# EAGLE schematic kicker (EAGLE 9.2.2)
DDRAWN: 03/07/19; FINISH: HASL; MATERIAL: FR-4; NCHECKED: Daniel Yang; NDRAWN: Will Stuckey; REV: 3.1-IGBT-EMG57; SCALE: 1:1; TITLE: SSL Kicker

## Sheet 1 of 9: Power
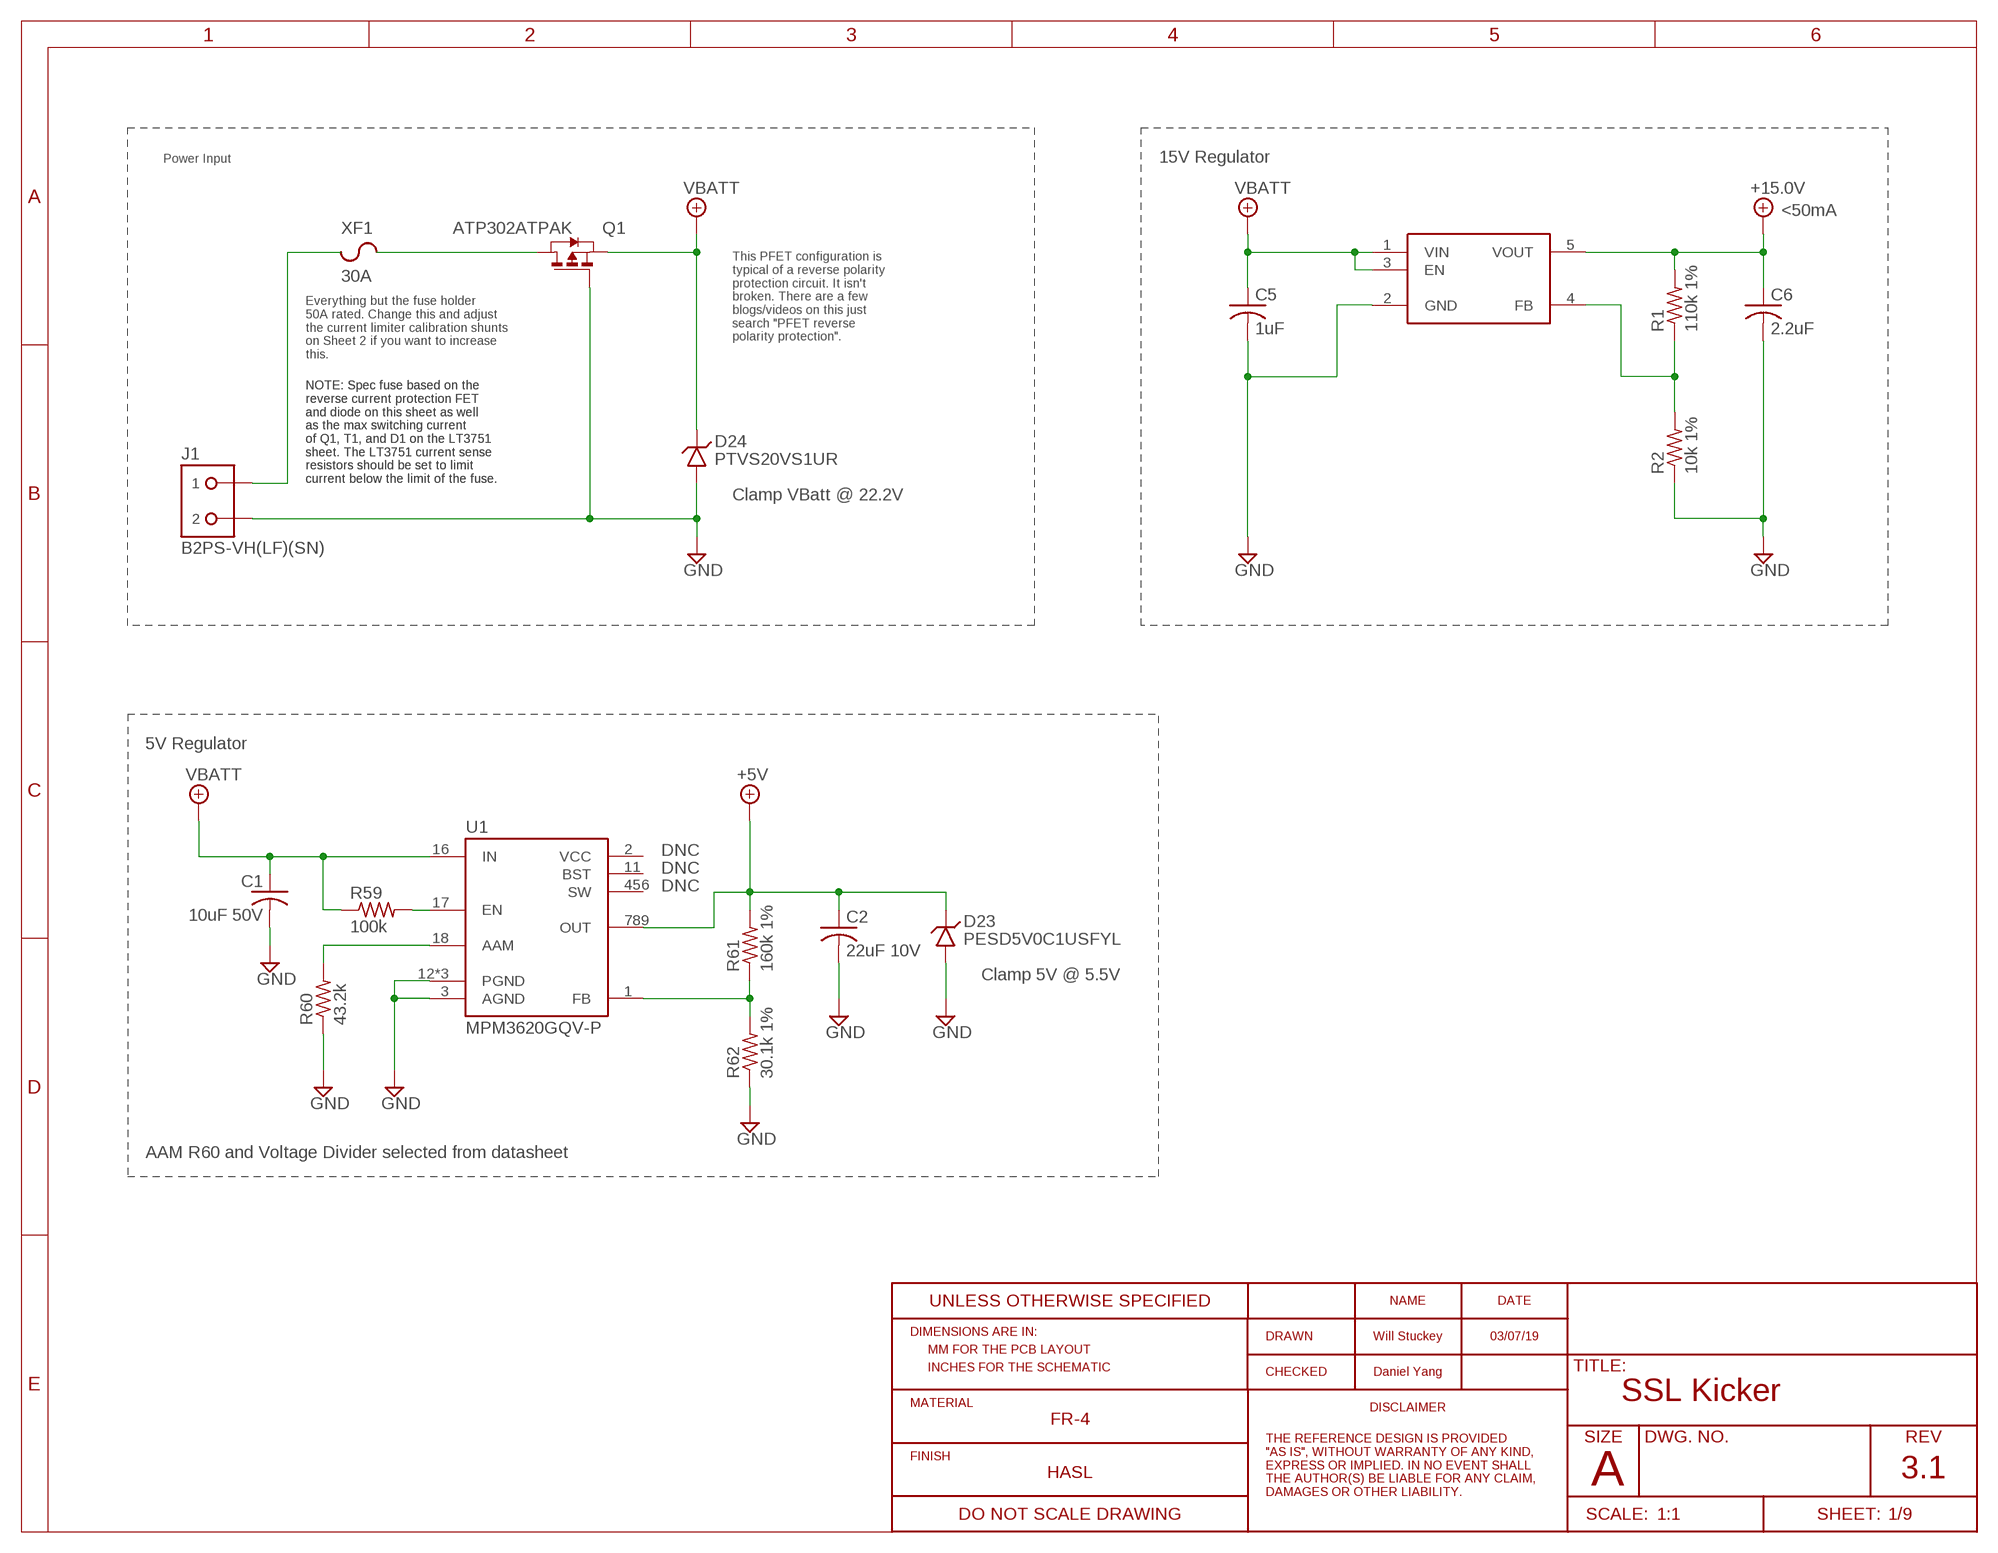
[diagram p0: schematic, sheet 1]
FRAME1 (RO_FRAME_A_L_20161226): REV: 3.1

### Parts
C1  10uF 50V  C-USC1206  [C1206]
C2  22uF 10V  C-USC0603  [C0603]
C5  1uF  C-USC0603  [C0603]
C6  2.2uF  C-USC0603  [C0603]
D23  PESD5V0C1USFYL  TVS0603  [R0603]
D24  PTVS20VS1UR  TVSSOD123W  [SOD123-W]
J1  B2PS-VH(LF)(SN)  [B2PS-CENTERED]
Q1  ATP302ATPAK  [TO460P950X150-3]
R1  110k 1%  R-US_R0603  [R0603]
R2  10k 1%  R-US_R0603  [R0603]
R59  100k  R-US_R0402  [R0402]
R60  43.2k  R-US_R0603  [R0603]
R61  160k 1%  R-US_R0402  [R0402]
R62  30.1k 1%  R-US_R0402  [R0402]
U1  MPM3620GQV-P  [MPM3620GQV-P]
U2  15V  MIC5235YM5SOT-23-5  [SOT95P280X145-5]
XF1  30A  3557-2  [3557-2]

### Nets
+5V: C2.1 D23.2(C) R61.2 U1.789(OUT) ; also sheet 3,6,7,8,9
+15.0V: C6.1 R1.2 U2.5(VOUT) ; also sheet 4,7
FB: R61.1 R62.2 U1.1(FB)
GND: C1.2 C2.2 C5.2 C6.2 D23.1(A) D24.A J1.2 Q1.1(G) R2.1 R60.1 R62.1 U1.3(AGND) U1.12(PGND) U1.13(PGND) U1.14(PGND) U2.2(GND) ; also sheet 2,3,4,5,6,7,8,9
N$9: Q1.3(D) XF1.3 XF1.4
N$16: R1.1 R2.2 U2.4(FB)
N$39: J1.1 XF1.1 XF1.2
REG_AAM: R60.2 U1.18(AAM)
REG_EN: R59.2 U1.17(EN)
VBATT: C1.1 C5.1 D24.C Q1.2(S) R59.1 U1.16(IN) U2.1(VIN) U2.3(EN) ; also sheet 2,3,5
Unconnected: U1.2(VCC) U1.11(BST) U1.456(SW)

### Notes on the sheet
- Power Input | 15V Regulator
- <50mA
- This PFET configuration is 
  typical of a reverse polarity 
  protection circuit. It isn't 
  broken. There are a few 
  blogs/videos on this just 
  search "PFET reverse 
  polarity protection".
- Everything but the fuse holder
  50A rated. Change this and adjust
  the current limiter calibration shunts
  on Sheet 2 if you want to increase
  this.
- NOTE: Spec fuse based on the
  reverse current protection FET
  and diode on this sheet as well
  as the max switching current
  of Q1, T1, and D1 on the LT3751
  sheet. The LT3751 current sense
  resistors should be set to limit
  current below the limit of the fuse.
- NOTE: Spec fuse based on the
  reverse current protection FET
  and diode on this sheet as well
  as the max switching current
  of Q1, T1, and D1 on the LT3751
  sheet. The LT3751 current sense
  resistors should be set to limit
  current below the limit of the fuse.
- Clamp VBatt @ 22.2V
- 5V Regulator
- DNC
- DNC
- DNC
- Clamp 5V @ 5.5V
- AAM R60 and Voltage Divider selected from datasheet

## Sheet 2 of 9: HV - Regulation
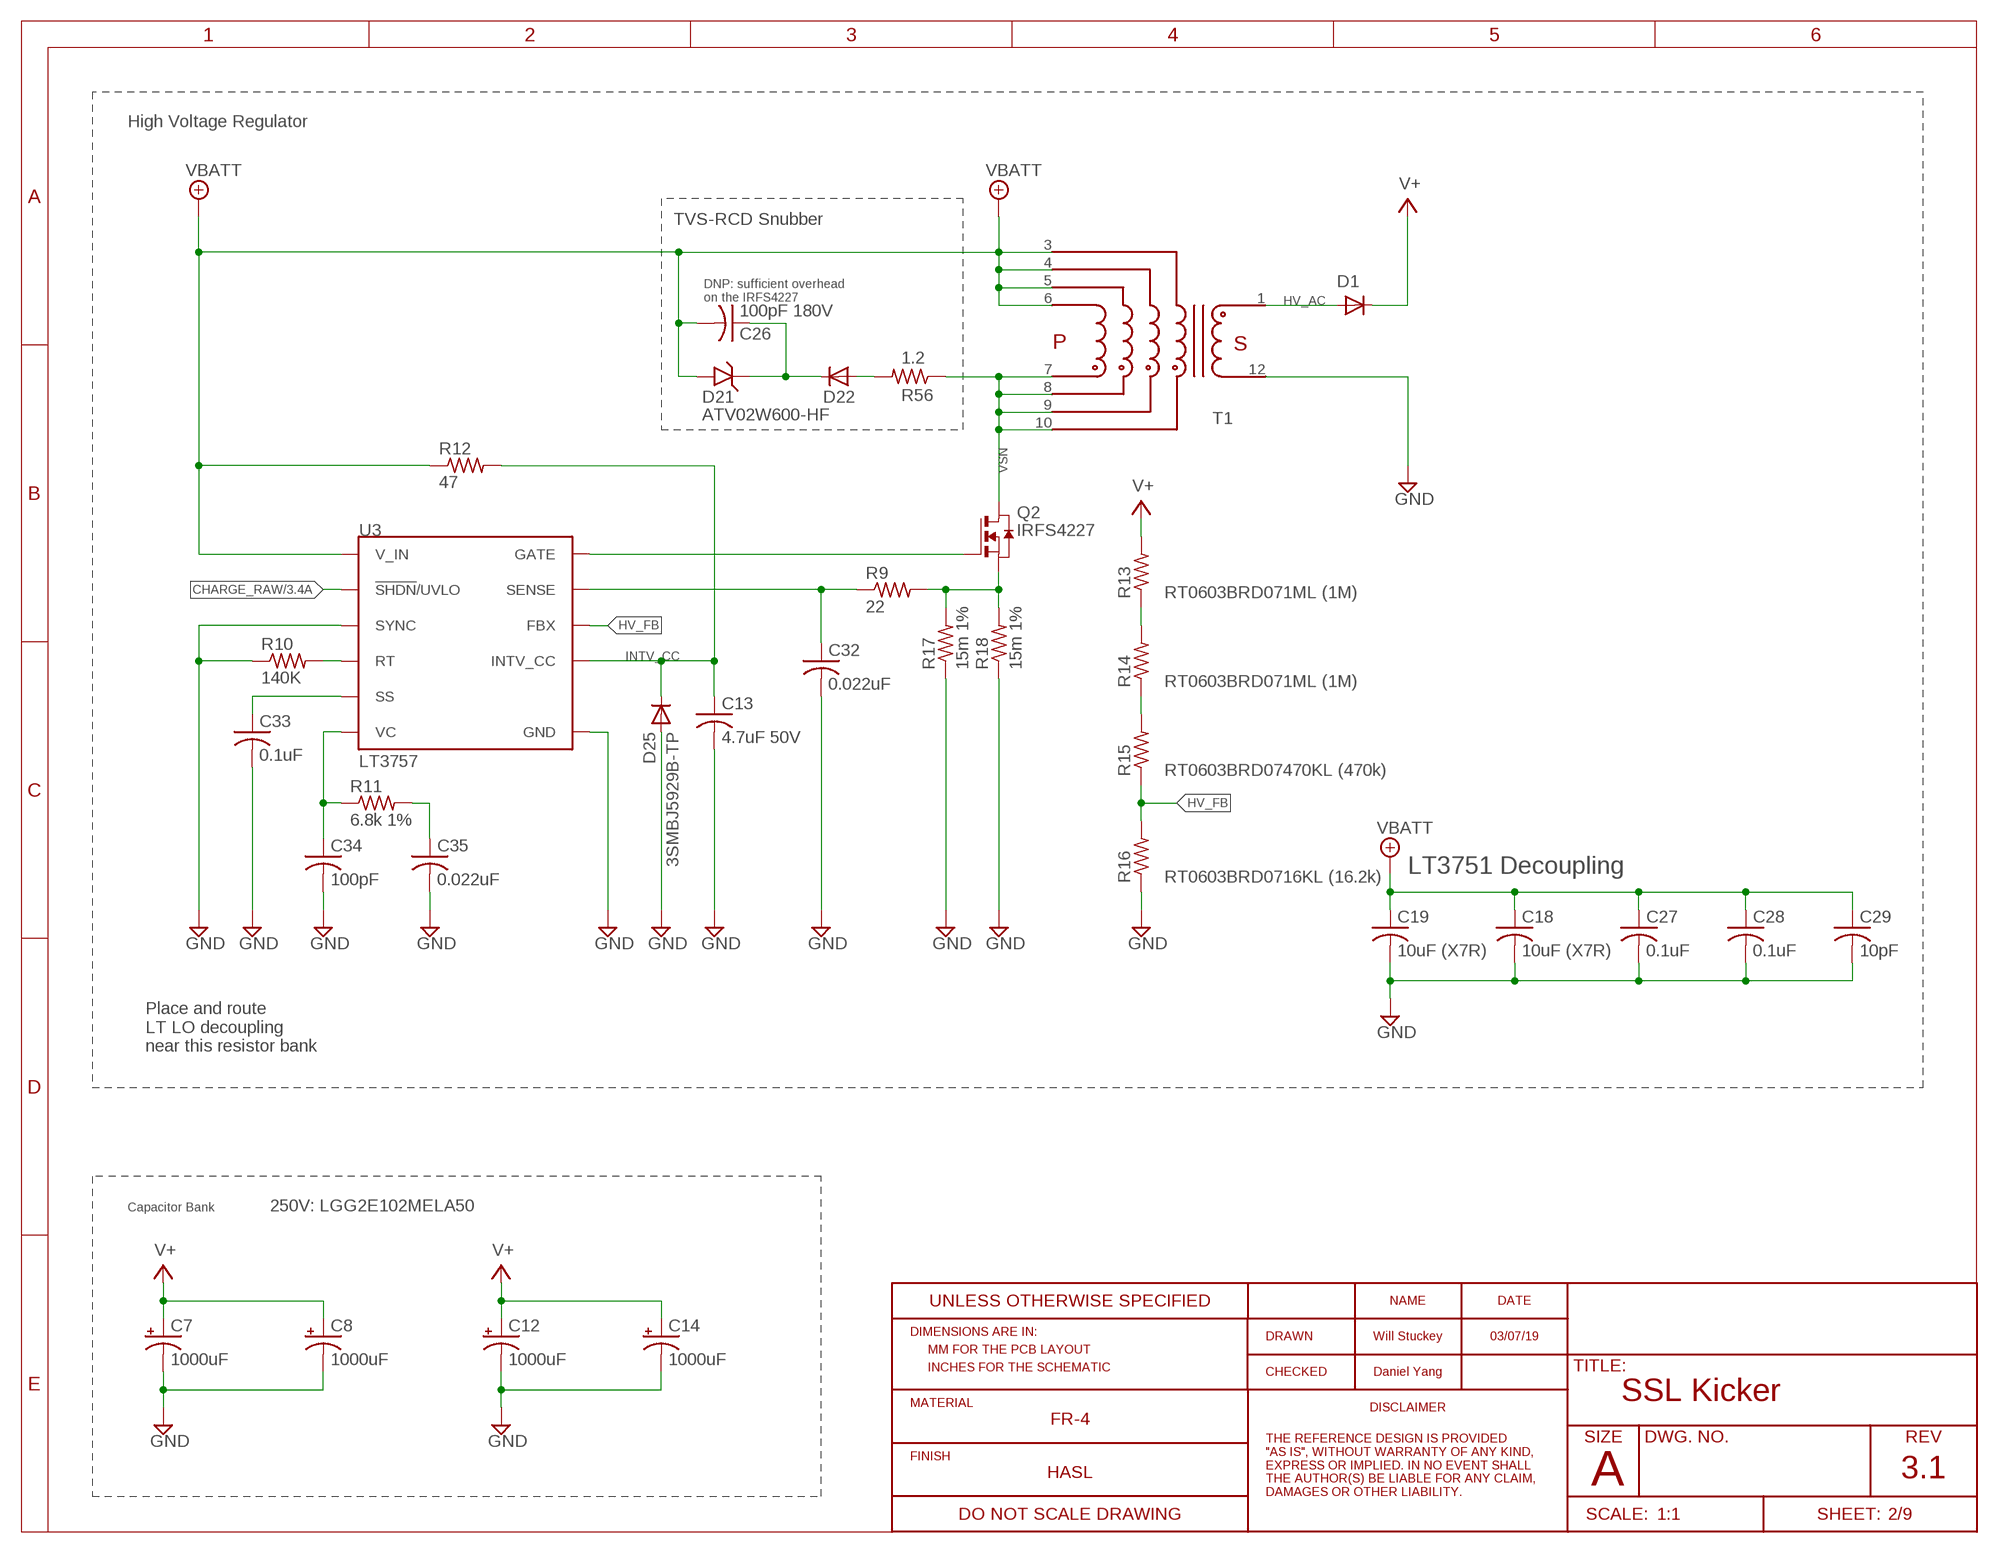
[diagram p1: schematic, sheet 2]
FRAME2 (RO_FRAME_A_L_20161226): REV: 3.1

### Parts
C7  1000uF  CPOL-USE10-25  [EB25D]
C8  1000uF  CPOL-USE10-25  [EB25D]
C12  1000uF  CPOL-USE10-25  [EB25D]
C13  4.7uF 50V  C-USC0805  [C0805]
C14  1000uF  CPOL-USE10-25  [EB25D]
C18  10uF (X7R)  C-USC1210  [C1210]
C19  10uF (X7R)  C-USC1210  [C1210]
C26  100pF 180V  C-USC0805  [C0805]
C27  0.1uF  C-USC0603  [C0603]
C28  0.1uF  C-USC0603  [C0603]
C29  10pF  C-USC0603  [C0603]
C32  0.022uF  C-USC0603  [C0603]
C33  0.1uF  C-USC0603  [C0603]
C34  100pF  C-USC0603  [C0603]
C35  0.022uF  C-USC0603  [C0603]
D1  VS-5EWH06FN-M3D-PAK_TO252AA  [TO460P990X239-3]
D21  ATV02W600-HF  TVSSOD123W  [SOD123-W]
D22  VS-5EWH06FN-M3D-PAK_TO252AA  [TO460P990X239-3]
D25  3SMBJ5929B-TP  DIODE-DO214AA  [DO214AA]
Q2  IRFS4227  [D2PAK]
R9  22  R-US_R1206  [R1206]
R10  140K  R-US_R0603  [R0603]
R11  6.8k 1%  R-US_R0603  [R0603]
R12  47  R-US_R2512  [R2512]
R13  RT0603BRD071ML (1M)  R-US_R0603  [R0603]
R14  RT0603BRD071ML (1M)  R-US_R0603  [R0603]
R15  RT0603BRD07470KL (470k)  R-US_R0603  [R0603]
R16  RT0603BRD0716KL (16.2k)  R-US_R0603  [R0603]
R17  15m 1%  R-US_R2512  [R2512]
R18  15m 1%  R-US_R2512  [R2512]
R56  1.2  R-US_R0805  [R0805]
T1  DA203X-ALDA2034  [DA2034]
U3  LT3757  [MSOP-10-MSE]

### Nets
CHARGE_RAW: U3.9(!SHDN!/UVLO) ; also sheet 3
GND: C7.- C8.- C12.- C13.2 C14.- C18.2 C19.2 C27.2 C28.2 C29.2 C32.2 C33.2 C34.2 C35.2 D25.A R10.1 R16.1 R17.1 R18.1 T1.12 U3.5(SYNC) U3.11(GND) ; also sheet 1,3,4,5,6,7,8,9
HV_AC: D1.2(A) T1.1
HV_FB: R15.1 R16.2 U3.2(FBX)
HVGATE: Q2.1(G) U3.7(GATE)
INTV_CC: C13.1 D25.C R12.2 U3.8(INTV_CC)
N$2: R13.1 R14.2
N$6: R14.1 R15.2
N$15: C35.1 R11.2
N$18: D22.2(A) R56.2
N$23: C26.1 D21.C D22.3(C)
RT: R10.2 U3.4(RT)
SENSE: C32.1 R9.1 U3.6(SENSE)
SENSE_RAW: Q2.3(S) R9.2 R17.2 R18.2
SS: C33.1 U3.3(SS)
V+: C7.+ C8.+ C12.+ C14.+ D1.3(C) R13.2 ; also sheet 4,5,6,7
VBATT: C18.1 C19.1 C26.2 C27.1 C28.1 C29.1 D21.A R12.1 T1.3 T1.4 T1.5 T1.6 U3.10(V_IN) ; also sheet 1,3,5
VC: C34.1 R11.1 U3.1(VC)
VSN: Q2.2(D) R56.1 T1.7 T1.8 T1.9 T1.10

### Notes on the sheet
- High Voltage Regulator
- TVS-RCD Snubber
- DNP: sufficient overhead 
  on the IRFS4227
- LT3751 Decoupling
- Place and route 
  LT LO decoupling 
  near this resistor bank
- Capacitor Bank | 250V: LGG2E102MELA50

## Sheet 3 of 9: HV - Control & Bypass
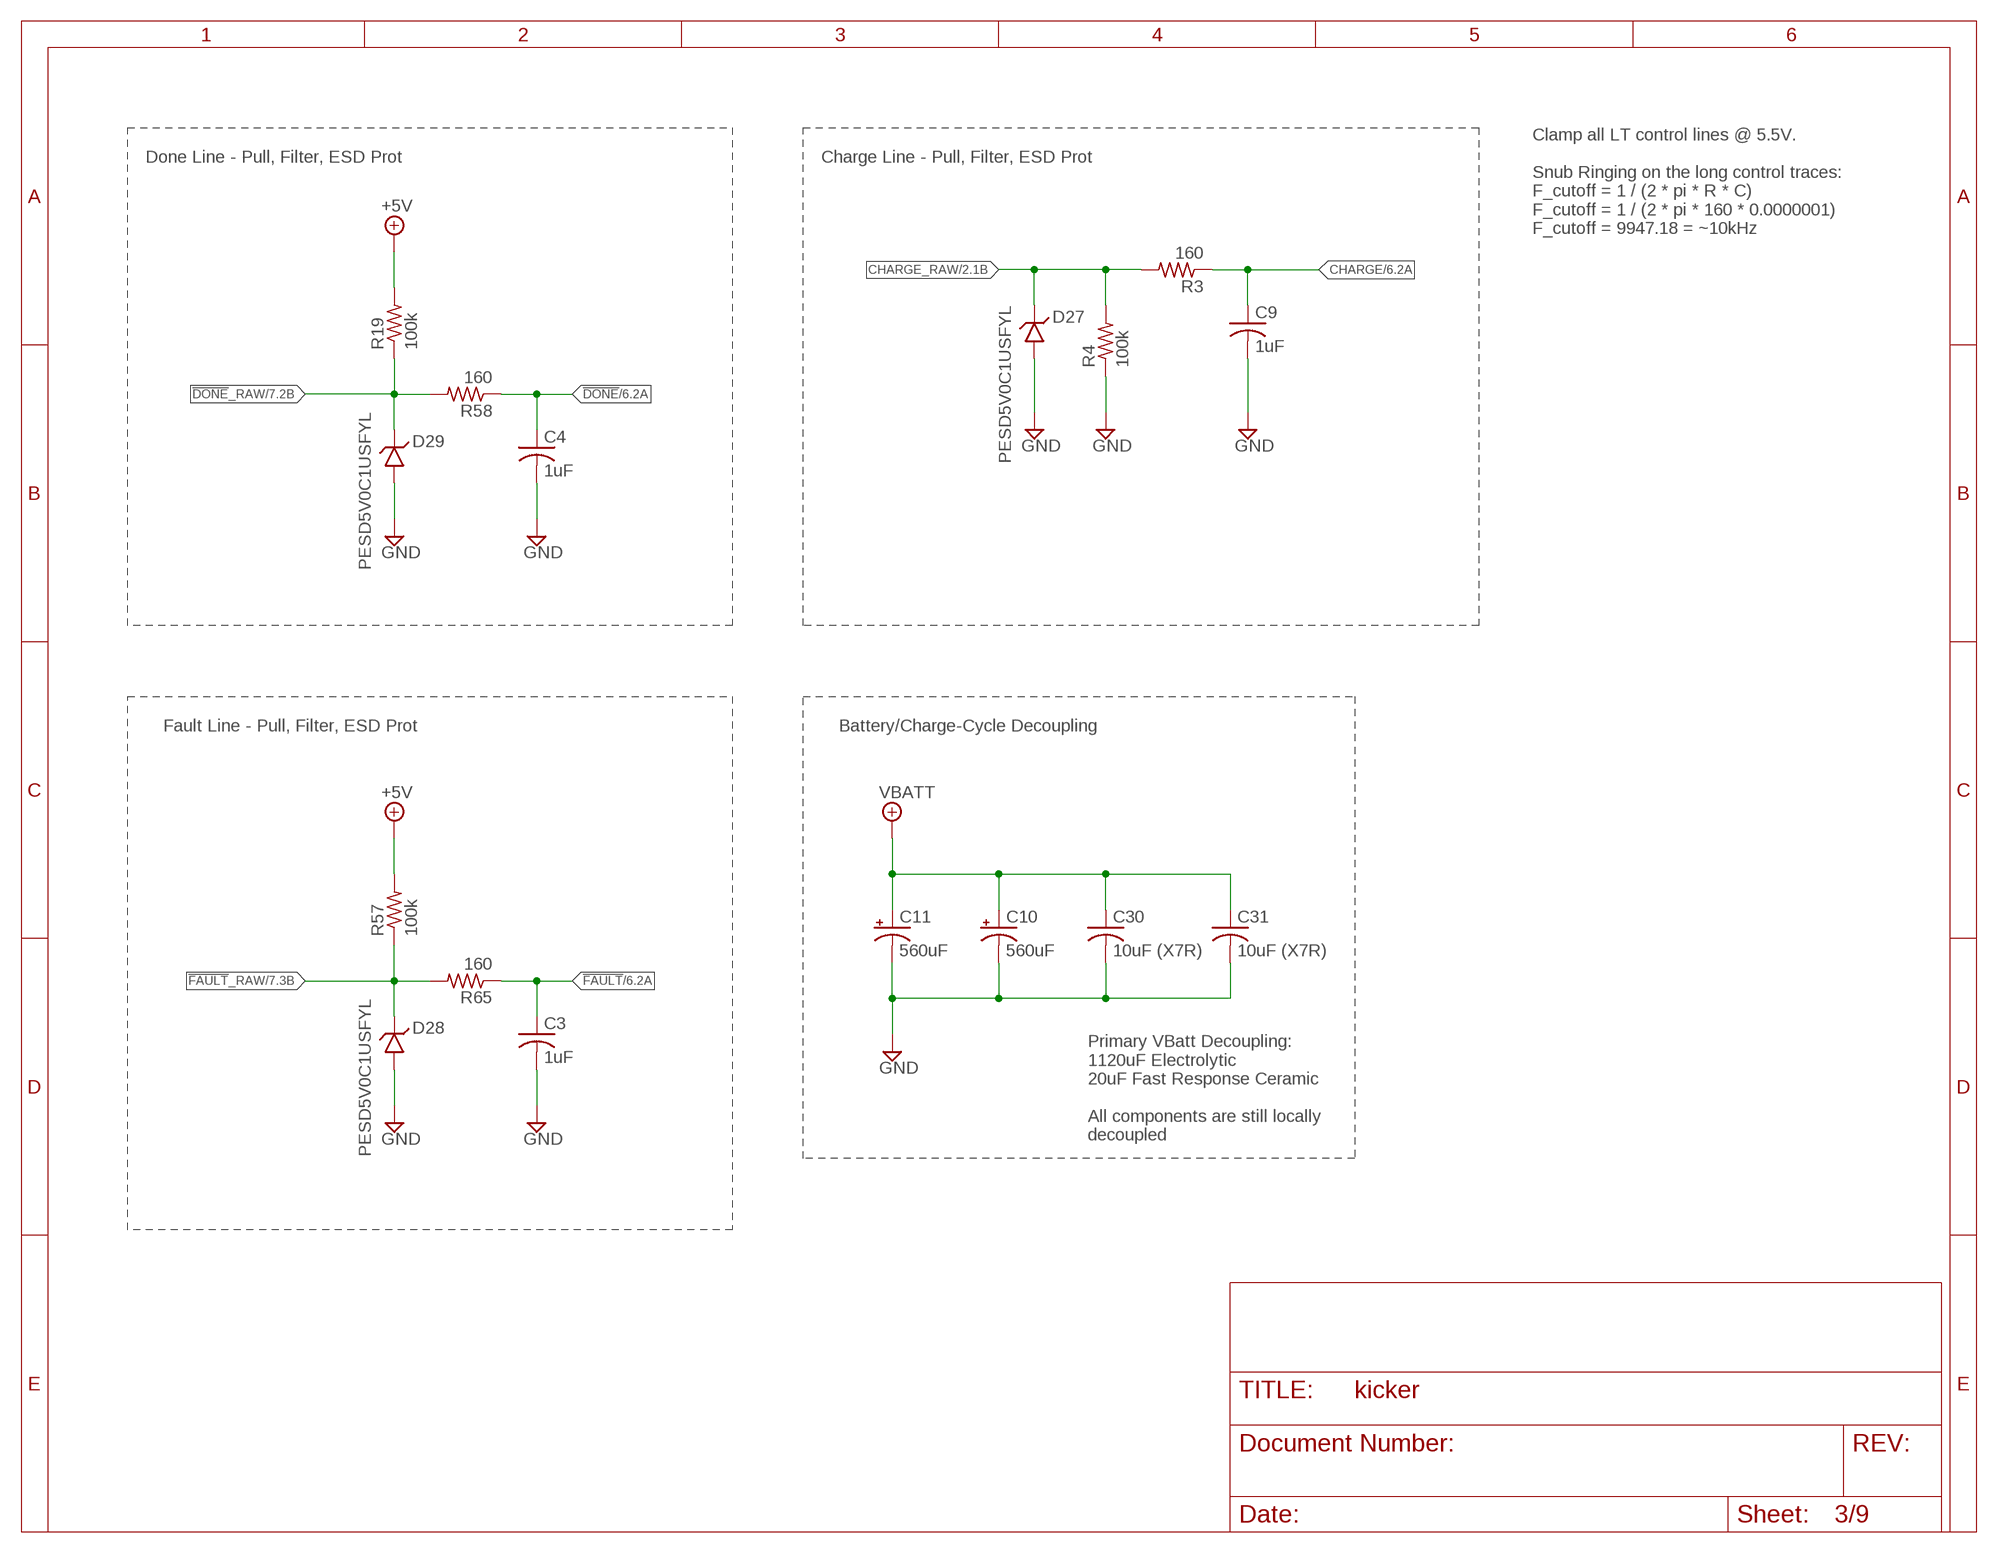
[diagram p2: schematic, sheet 3]

### Parts
C3  1uF  C-USC0603  [C0603]
C4  1uF  C-USC0603  [C0603]
C9  1uF  C-USC0603  [C0603]
C10  560uF  CPOL-USE7.5-18  [E7,5-18]
C11  560uF  CPOL-USE7.5-18  [E7,5-18]
C30  10uF (X7R)  C-USC1210  [C1210]
C31  10uF (X7R)  C-USC1210  [C1210]
D27  PESD5V0C1USFYL  TVS0603  [R0603]
D28  PESD5V0C1USFYL  TVS0603  [R0603]
D29  PESD5V0C1USFYL  TVS0603  [R0603]
R3  160  R-US_R0603  [R0603]
R4  100k  R-US_R0603  [R0603]
R19  100k  R-US_R0603  [R0603]
R57  100k  R-US_R0603  [R0603]
R58  160  R-US_R0603  [R0603]
R65  160  R-US_R0603  [R0603]

### Nets
!DONE!: C4.1 R58.1 ; also sheet 6
!DONE!_RAW: D29.2(C) R19.1 R58.2 ; also sheet 7
!FAULT!: C3.1 R65.1 ; also sheet 6
!FAULT!_RAW: D28.2(C) R57.1 R65.2 ; also sheet 7
+5V: R19.2 R57.2 ; also sheet 1,6,7,8,9
CHARGE: C9.1 R3.1 ; also sheet 6
CHARGE_RAW: D27.2(C) R3.2 R4.2 ; also sheet 2
GND: C3.2 C4.2 C9.2 C10.- C11.- C30.2 C31.2 D27.1(A) D28.1(A) D29.1(A) R4.1 ; also sheet 1,2,4,5,6,7,8,9
VBATT: C10.+ C11.+ C30.1 C31.1 ; also sheet 1,2,5

### Notes on the sheet
- Done Line - Pull, Filter, ESD Prot | Charge Line - Pull, Filter, ESD Prot
- Clamp all LT control lines @ 5.5V.
  
  Snub Ringing on the long control traces:
  F_cutoff = 1 / (2 * pi * R * C)
  F_cutoff = 1 / (2 * pi * 160 * 0.0000001)
  F_cutoff = 9947.18 = ~10kHz
- Fault Line - Pull, Filter, ESD Prot | Battery/Charge-Cycle Decoupling
- Primary VBatt Decoupling:
  1120uF Electrolytic
  20uF Fast Response Ceramic
  
  All components are still locally
  decoupled

## Sheet 4 of 9: HV - Kick Discharge
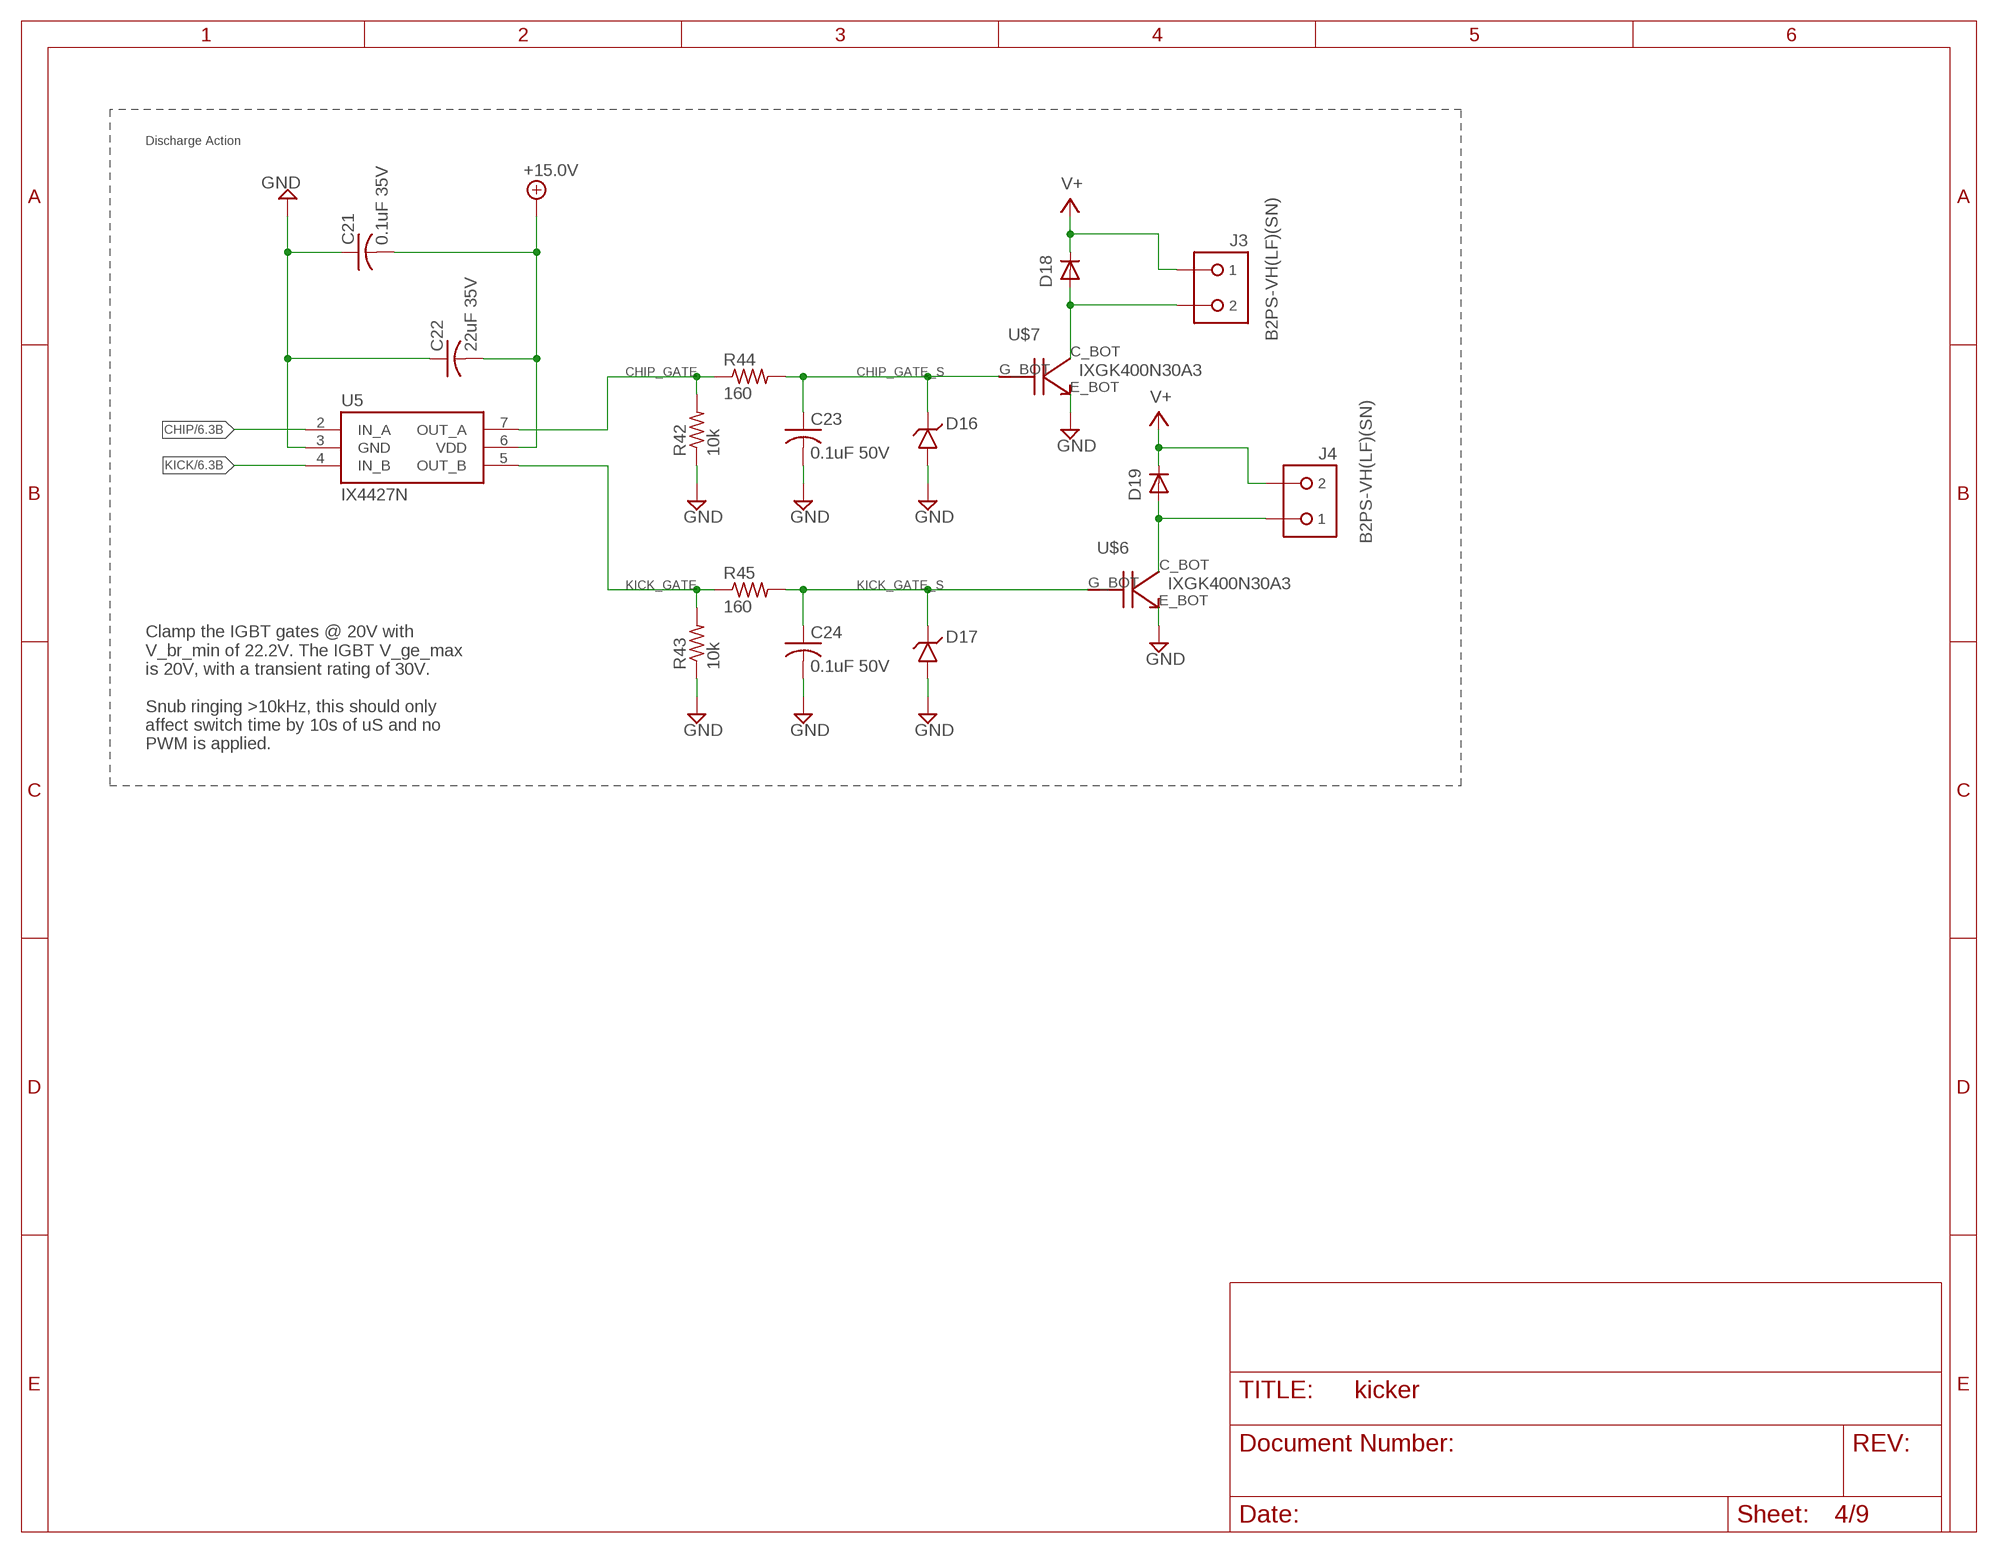
[diagram p3: schematic, sheet 4]

### Parts
C21  0.1uF 35V  C-USC0603  [C0603]
C22  22uF 35V  C-USC0805  [C0805]
C23  0.1uF 50V  C-USC0603  [C0603]
C24  0.1uF 50V  C-USC0603  [C0603]
D16  SMAJ20ADO-214AC  [RESM5226X262]
D17  SMAJ20ADO-214AC  [RESM5226X262]
D18  VS-5EWH06FN-M3D-PAK_TO252AA  [TO460P990X239-3]
D19  VS-5EWH06FN-M3D-PAK_TO252AA  [TO460P990X239-3]
J3  B2PS-VH(LF)(SN)  [B2PS-CENTERED]
J4  B2PS-VH(LF)(SN)  [B2PS-CENTERED]
R42  10k  R-US_R0603  [R0603]
R43  10k  R-US_R0603  [R0603]
R44  160  R-US_R1206  [R1206]
R45  160  R-US_R1206  [R1206]
U5  IX4427N  [SOIC-8]
U$6  IXGK400N30A3  [TO264]
U$7  IXGK400N30A3  [TO264]

### Nets
+15.0V: C21.2 C22.2 U5.6(VDD) ; also sheet 1,7
CHIP: U5.2(IN_A) ; also sheet 6
CHIP_GATE: R42.2 R44.1 U5.7(OUT_A)
CHIP_GATE_S: C23.1 D16.2(C) R44.2 U$7.G_BOT(G)
CHIPPER: D18.2(A) J3.2 U$7.C_BOT(C)
GND: C21.1 C22.1 C23.2 C24.2 D16.1(A) D17.1(A) R42.1 R43.1 U5.3(GND) U$6.E_BOT(E) U$7.E_BOT(E) ; also sheet 1,2,3,5,6,7,8,9
KICK: U5.4(IN_B) ; also sheet 6
KICK_GATE: R43.2 R45.1 U5.5(OUT_B)
KICK_GATE_S: C24.1 D17.2(C) R45.2 U$6.G_BOT(G)
KICKER: D19.2(A) J4.1 U$6.C_BOT(C)
V+: D18.3(C) D19.3(C) J3.1 J4.2 ; also sheet 2,5,6,7

### Notes on the sheet
- Discharge Action
- Clamp the IGBT gates @ 20V with
  V_br_min of 22.2V. The IGBT V_ge_max 
  is 20V, with a transient rating of 30V.
  
  Snub ringing >10kHz, this should only
  affect switch time by 10s of uS and no
  PWM is applied.

## Sheet 5 of 9: HV - Auto Discharge
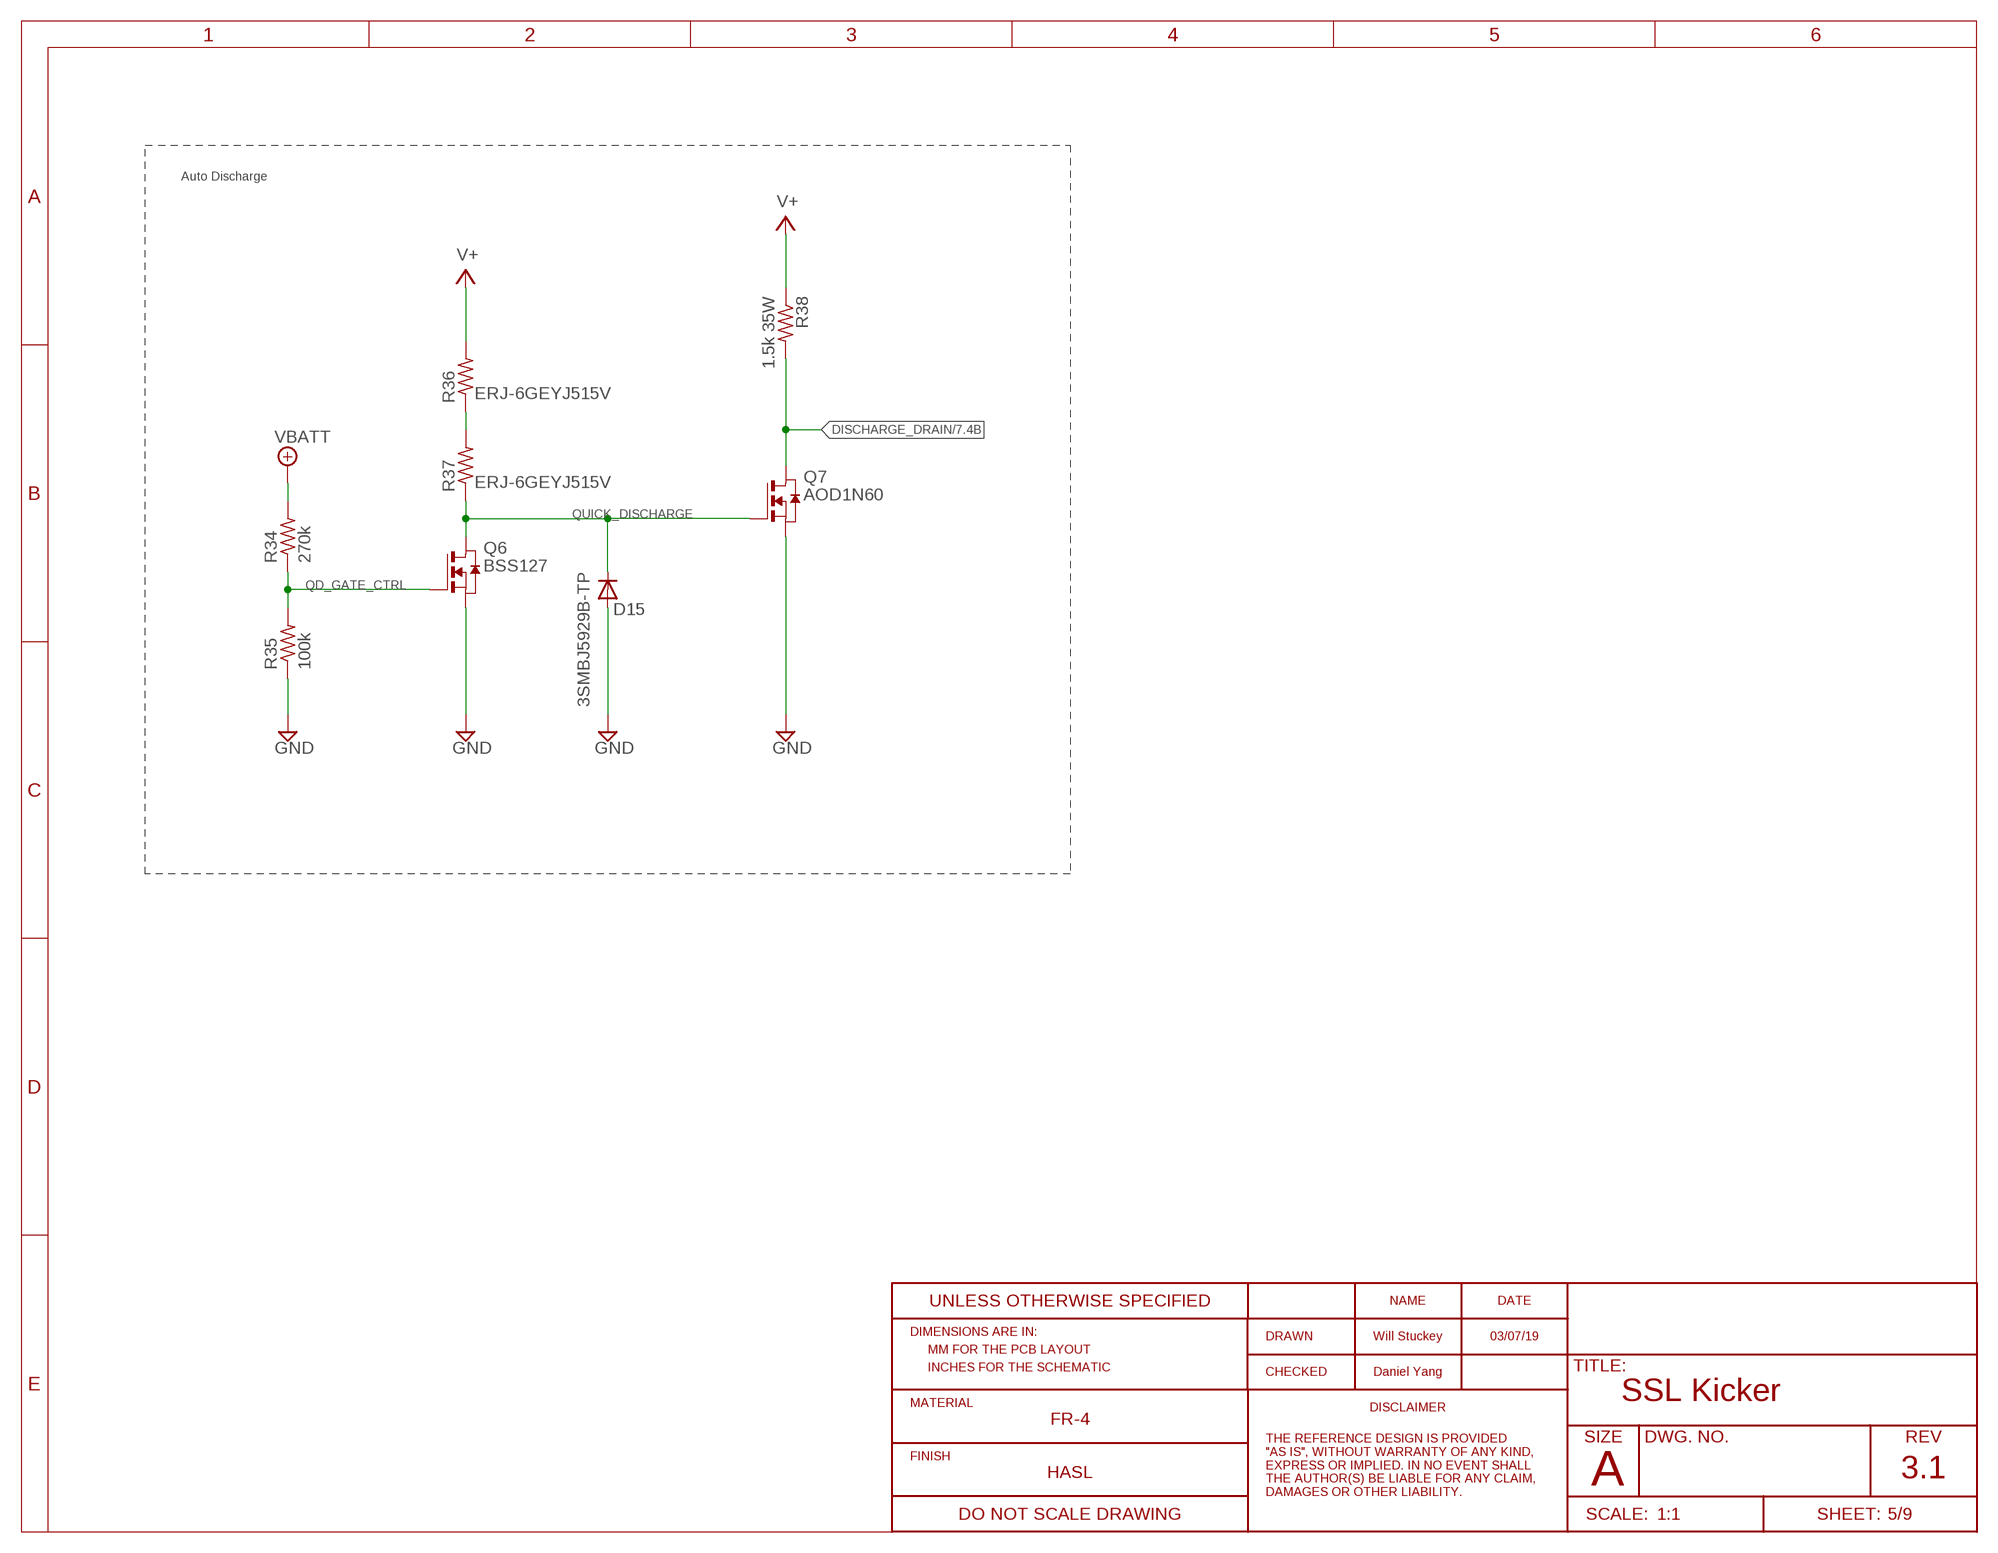
[diagram p4: schematic, sheet 5]
FRAME4 (RO_FRAME_A_L_20161226): REV: 3.1

### Parts
D15  3SMBJ5929B-TP  DIODE-DO214AA  [DO214AA]
Q6  BSS127  [SOT-23-3]
Q7  AOD1N60  [DPAK]
R34  270k  R-US_R0603  [R0603]
R35  100k  R-US_R0603  [R0603]
R36  ERJ-6GEYJ515V  R-US_R0805  [R0805]
R37  ERJ-6GEYJ515V  R-US_R0805  [R0805]
R38  1.5k 35W  PWR263S-35TO-263AB  [TO508P1539X450-3]

### Nets
DISCHARGE_DRAIN: Q7.FIN(D) R38.2(PIN2) ; also sheet 7
GND: D15.A Q6.2(S) Q7.3(S) R35.1 ; also sheet 1,2,3,4,6,7,8,9
QD_GATE_CTRL: Q6.1(G) R34.1 R35.2
QD_PU_BR: R36.1 R37.2
QUICK_DISCHARGE: D15.C Q6.3(D) Q7.1(G) R37.1
V+: R36.2 R38.1(PIN1) ; also sheet 2,4,6,7
VBATT: R34.2 ; also sheet 1,2,3

### Notes on the sheet
- Auto Discharge

## Sheet 6 of 9: MCU
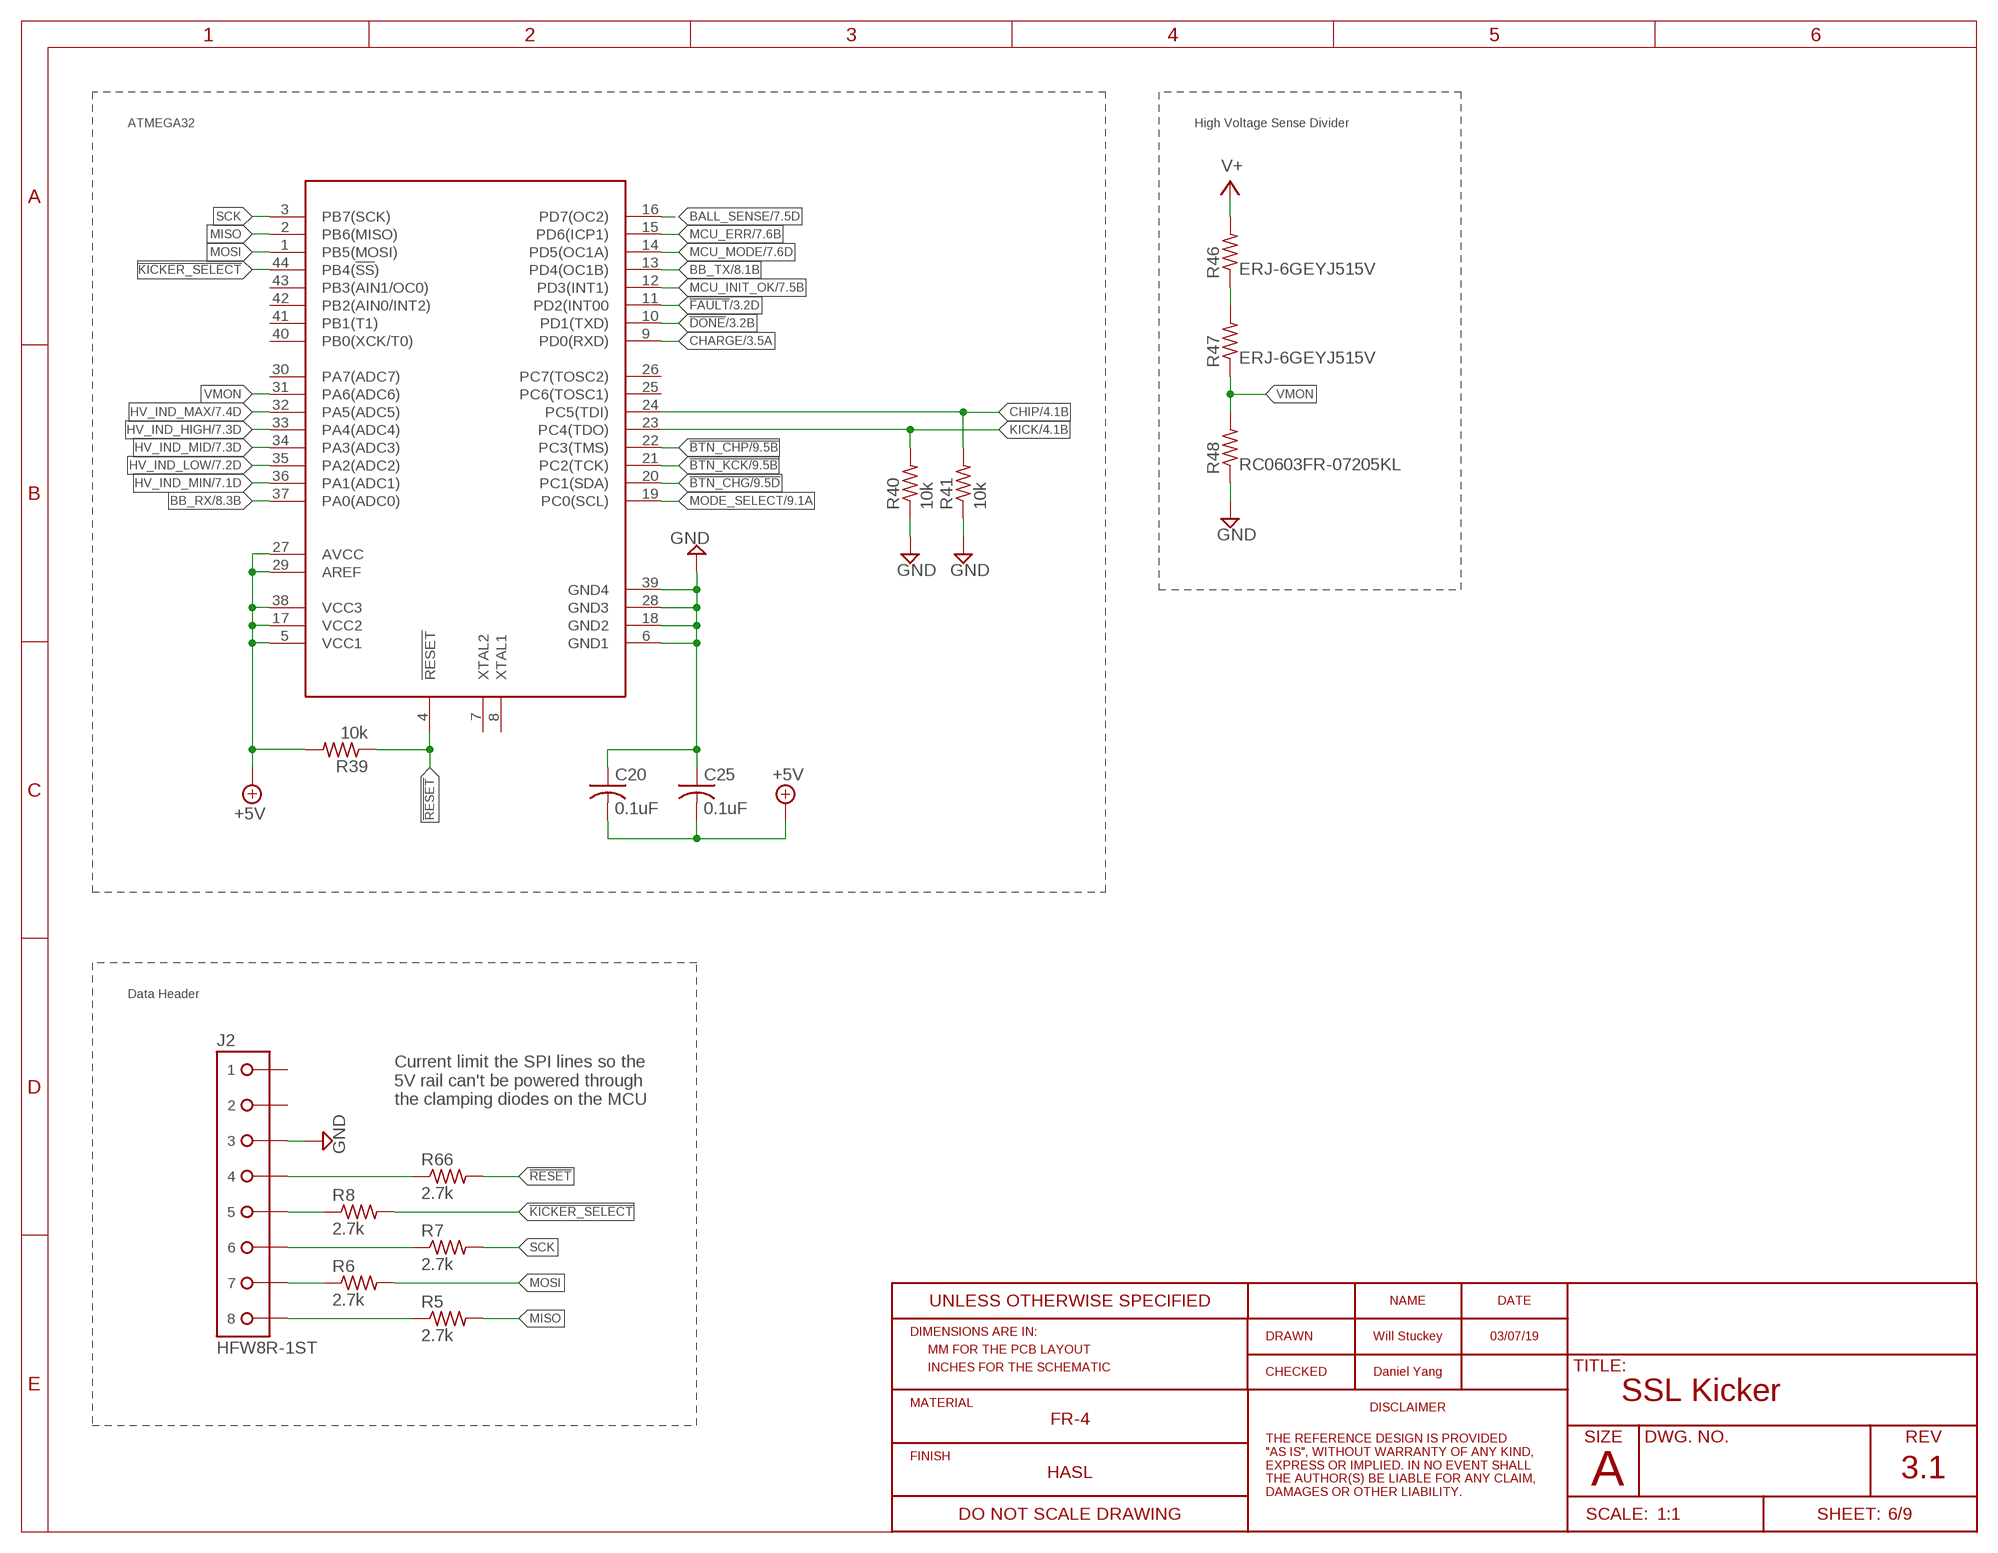
[diagram p5: schematic, sheet 6]
FRAME5 (RO_FRAME_A_L_20161226): REV: 3.1

### Parts
C20  0.1uF  C-USC0603  [C0603]
C25  0.1uF  C-USC0603  [C0603]
J2  HFW8R-1ST  [HFW8R-1ST]
R5  2.7k  R-US_R0603  [R0603]
R6  2.7k  R-US_R0603  [R0603]
R7  2.7k  R-US_R0603  [R0603]
R8  2.7k  R-US_R0603  [R0603]
R39  10k  R-US_R0603  [R0603]
R40  10k  R-US_R0603  [R0603]
R41  10k  R-US_R0603  [R0603]
R46  ERJ-6GEYJ515V  R-US_R0805  [R0805]
R47  ERJ-6GEYJ515V  R-US_R0805  [R0805]
R48  RC0603FR-07205KL  R-US_R0603  [R0603]
R66  2.7k  R-US_R0603  [R0603]
U4  AT32ATQFP44  [QFP80P1200X1200X120-44]

### Nets
!BTN_CHG: U4.20(PC1(SDA)) ; also sheet 9
!BTN_CHP: U4.22(PC3(TMS)) ; also sheet 9
!BTN_KCK: U4.21(PC2(TCK)) ; also sheet 9
!DONE!: U4.10(PD1(TXD)) ; also sheet 3
!FAULT!: U4.11(PD2(INT00) ; also sheet 3
!KICKER_SELECT: R8.2 U4.44(PB4(!SS!))
!KICKER_SELECT_CL: J2.5 R8.1
!RESET: R39.1 R66.2 U4.4(!RESET!)
!RESET_CL: J2.4 R66.1
+5V: C20.2 C25.2 R39.2 U4.5(VCC1) U4.17(VCC2) U4.27(AVCC) U4.29(AREF) U4.38(VCC3) ; also sheet 1,3,7,8,9
BALL_SENSE: U4.16(PD7(OC2)) ; also sheet 7
BB_RX: U4.37(PA0(ADC0)) ; also sheet 8
BB_TX: U4.13(PD4(OC1B)) ; also sheet 8
CHARGE: U4.9(PD0(RXD)) ; also sheet 3
CHIP: R41.2 U4.24(PC5(TDI)) ; also sheet 4
GND: C20.1 C25.1 J2.3 R40.1 R41.1 R48.1 U4.6(GND1) U4.18(GND2) U4.28(GND3) U4.39(GND4) ; also sheet 1,2,3,4,5,7,8,9
HV_IND_HIGH: U4.33(PA4(ADC4)) ; also sheet 7
HV_IND_LOW: U4.35(PA2(ADC2)) ; also sheet 7
HV_IND_MAX: U4.32(PA5(ADC5)) ; also sheet 7
HV_IND_MID: U4.34(PA3(ADC3)) ; also sheet 7
HV_IND_MIN: U4.36(PA1(ADC1)) ; also sheet 7
HV_SENSE_DIV_BR: R46.1 R47.2
KICK: R40.2 U4.23(PC4(TDO)) ; also sheet 4
MCU_ERR: U4.15(PD6(ICP1)) ; also sheet 7
MCU_INIT_OK: U4.12(PD3(INT1)) ; also sheet 7
MCU_MODE: U4.14(PD5(OC1A)) ; also sheet 7
MISO: R5.2 U4.2(PB6(MISO))
MISO_CL: J2.8 R5.1
MODE_SELECT: U4.19(PC0(SCL)) ; also sheet 9
MOSI: R6.2 U4.1(PB5(MOSI))
MOSI_CL: J2.7 R6.1
SCK: R7.2 U4.3(PB7(SCK))
SCK_CL: J2.6 R7.1
V+: R46.2 ; also sheet 2,4,5,7
VMON: R47.1 R48.2 U4.31(PA6(ADC6))
Unconnected: J2.1 J2.2 J2.LEG1 J2.LEG2 U4.7(XTAL2) U4.8(XTAL1) U4.25(PC6(TOSC1)) U4.26(PC7(TOSC2)) U4.30(PA7(ADC7)) U4.40(PB0(XCK/T0)) U4.41(PB1(T1)) U4.42(PB2(AIN0/INT2)) U4.43(PB3(AIN1/OC0))

### Notes on the sheet
- ATMEGA32 | High Voltage Sense Divider
- Data Header
- Current limit the SPI lines so the 
  5V rail can't be powered through 
  the clamping diodes on the MCU

## Sheet 7 of 9: LED Indicators
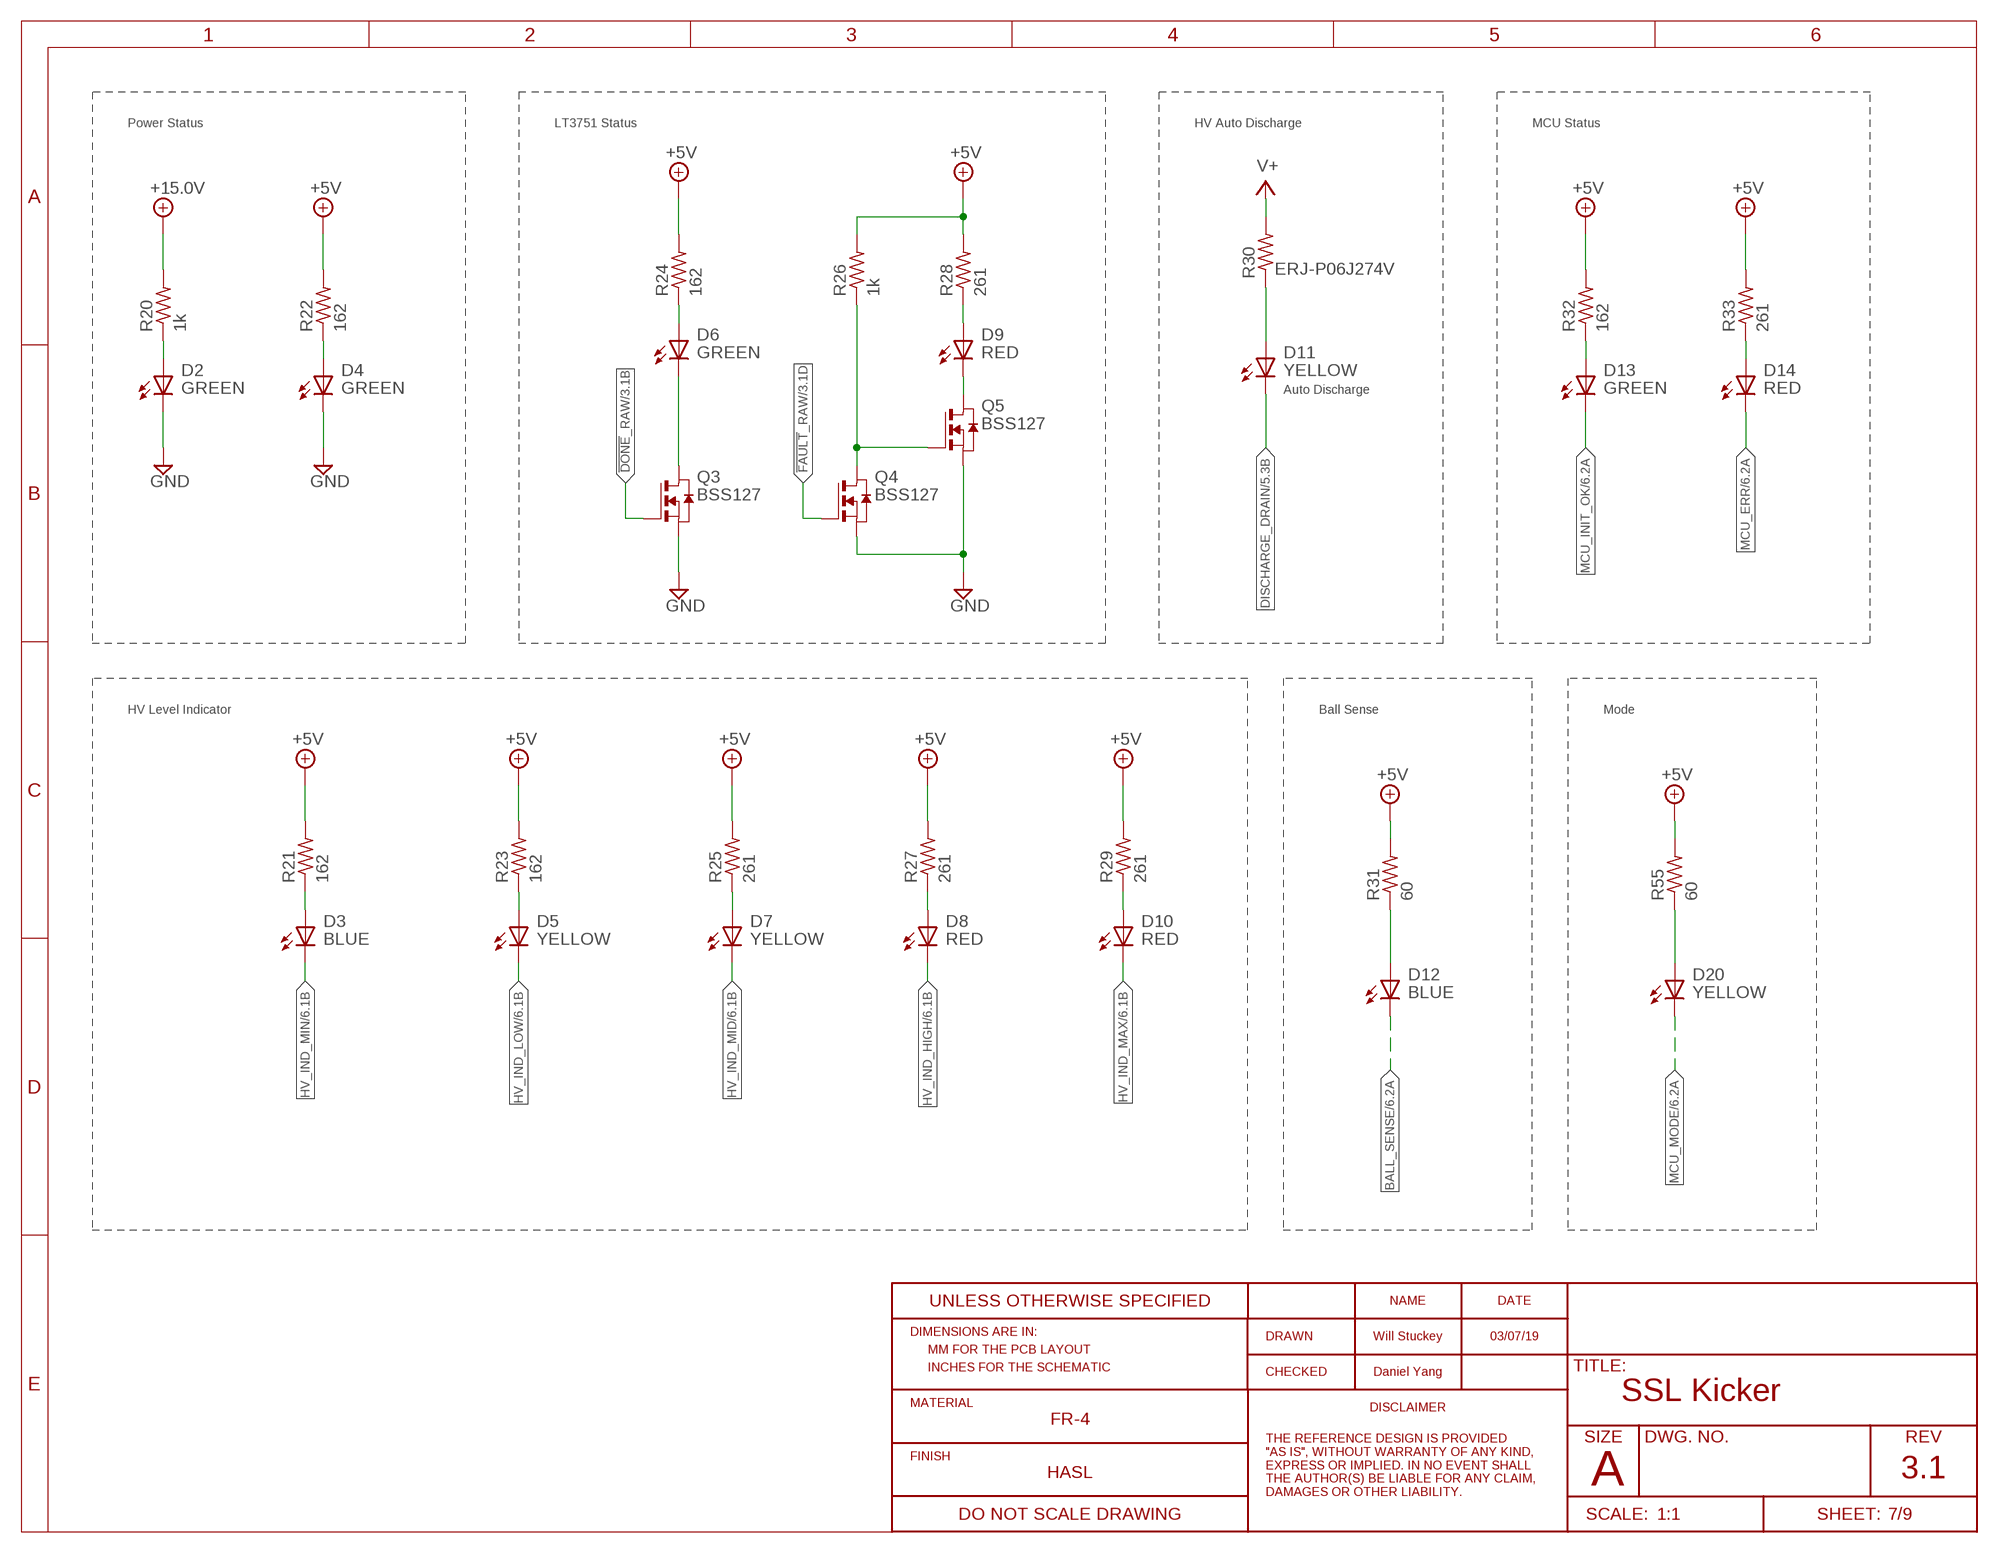
[diagram p6: schematic, sheet 7]
FRAME3 (RO_FRAME_A_L_20161226): REV: 3.1

### Parts
D2  GREEN  LED-SMD-GREEN  [CHIP-LED0603]
D3  BLUE  LED-SMD-BLUE  [CHIP-LED0603]
D4  GREEN  LED-SMD-GREEN  [CHIP-LED0603]
D5  YELLOW  LED-SMD-YELLOW  [CHIP-LED0603]
D6  GREEN  LED-SMD-GREEN  [CHIP-LED0603]
D7  YELLOW  LED-SMD-YELLOW  [CHIP-LED0603]
D8  RED  LED-SMD-RED  [CHIP-LED0603]
D9  RED  LED-SMD-RED  [CHIP-LED0603]
D10  RED  LED-SMD-RED  [CHIP-LED0603]
D11  YELLOW  LED-SMD-YELLOW  [CHIP-LED0603]
D12  BLUE  LED-SMD-BLUE  [CHIP-LED0603]
D13  GREEN  LED-SMD-GREEN  [CHIP-LED0603]
D14  RED  LED-SMD-RED  [CHIP-LED0603]
D20  YELLOW  LED-SMD-YELLOW  [CHIP-LED0603]
Q3  BSS127  [SOT-23-3]
Q4  BSS127  [SOT-23-3]
Q5  BSS127  [SOT-23-3]
R20  1k  R-US_R0603  [R0603]
R21  162  R-US_R0603  [R0603]
R22  162  R-US_R0603  [R0603]
R23  162  R-US_R0603  [R0603]
R24  162  R-US_R0603  [R0603]
R25  261  R-US_R0603  [R0603]
R26  1k  R-US_R0603  [R0603]
R27  261  R-US_R0603  [R0603]
R28  261  R-US_R0603  [R0603]
R29  261  R-US_R0603  [R0603]
R30  ERJ-P06J274V  R-US_R0805  [R0805]
R31  60  R-US_R0603  [R0603]
R32  162  R-US_R0603  [R0603]
R33  261  R-US_R0603  [R0603]
R55  60  R-US_R0603  [R0603]

### Nets
15V_PWR_BR: D2.A R20.1
!DONE!_RAW: Q3.1(G) ; also sheet 3
!FAULT!_RAW: Q4.1(G) ; also sheet 3
+5V: R21.2 R22.2 R23.2 R24.2 R25.2 R26.2 R27.2 R28.2 R29.2 R31.2 R32.2 R33.2 R55.2 ; also sheet 1,3,6,8,9
+15.0V: R20.2 ; also sheet 1,4
BALL_SENSE: D12.C(K) ; also sheet 6
DISCHARGE_DRAIN: D11.C(K) ; also sheet 5
FAULT_INV_BR: Q4.3(D) Q5.1(G) R26.1
GND: D2.C(K) D4.C(K) Q3.2(S) Q4.2(S) Q5.2(S) ; also sheet 1,2,3,4,5,6,8,9
HV_IND_HIGH: D8.C(K) ; also sheet 6
HV_IND_LOW: D5.C(K) ; also sheet 6
HV_IND_MAX: D10.C(K) ; also sheet 6
HV_IND_MID: D7.C(K) ; also sheet 6
HV_IND_MIN: D3.C(K) ; also sheet 6
MCU_ERR: D14.C(K) ; also sheet 6
MCU_INIT_OK: D13.C(K) ; also sheet 6
MCU_MODE: D20.C(K) ; also sheet 6
N$3: D14.A R33.1
N$4: D13.A R32.1
N$5: D6.A R24.1
N$11: D3.A R21.1
N$12: D5.A R23.1
N$13: D7.A R25.1
N$17: D20.A R55.1
N$20: D4.A R22.1
N$21: D8.A R27.1
N$27: D9.A R28.1
N$28: D9.C(K) Q5.3(D)
N$29: D11.A R30.1
N$30: D10.A R29.1
N$37: D6.C(K) Q3.3(D)
N$40: D12.A R31.1
V+: R30.2 ; also sheet 2,4,5,6

### Notes on the sheet
- Power Status | LT3751 Status | HV Auto Discharge | MCU Status
- Auto Discharge
- HV Level Indicator | Ball Sense | Mode

## Sheet 8 of 9: Breakbeam
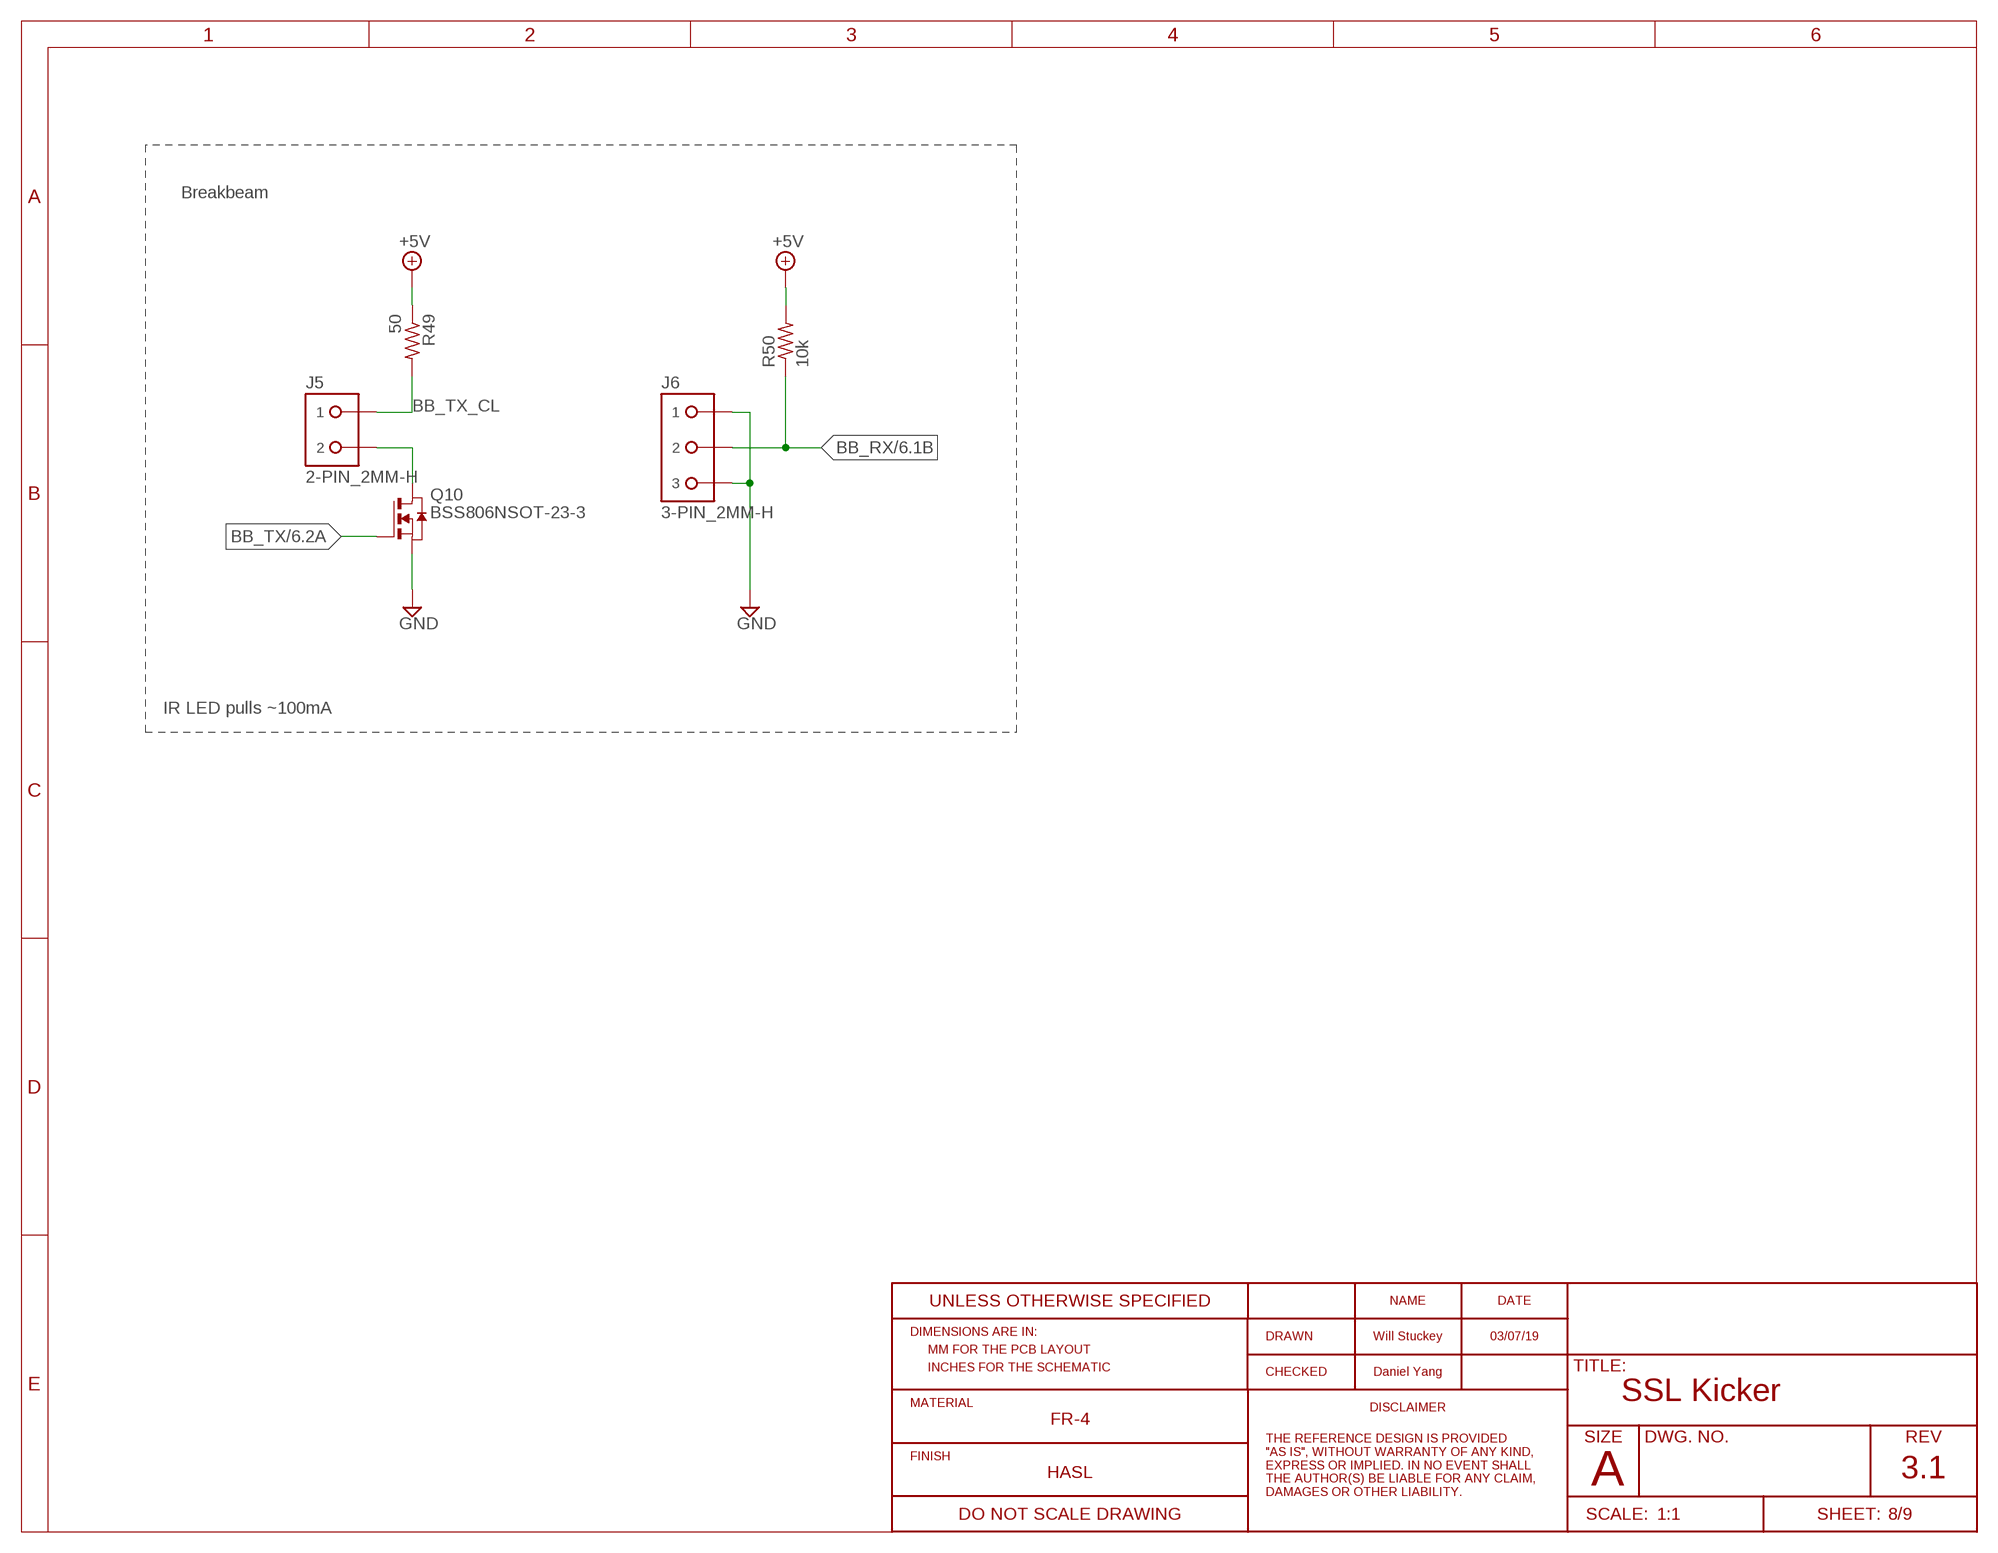
[diagram p7: schematic, sheet 8]
FRAME6 (RO_FRAME_A_L_20161226): REV: 3.1

### Parts
J5  2-PIN_2MM-H  [2MM-2-H]
J6  3-PIN_2MM-H  [2MM-3-H]
Q10  BSS806NSOT-23-3  [SOT95P240X110-3]
R49  50  R-US_R0603  [R0603]
R50  10k  R-US_R0603  [R0603]

### Nets
+5V: R49.1 R50.2 ; also sheet 1,3,6,7,9
BB_RX: J6.2 R50.1 ; also sheet 6
BB_TX: Q10.1(G) ; also sheet 6
BB_TX_CL: J5.1 R49.2
GND: J6.1 J6.3 Q10.2(S) ; also sheet 1,2,3,4,5,6,7,9
N$19: J5.2 Q10.3(D)

### Notes on the sheet
- Breakbeam
- IR LED pulls ~100mA

## Sheet 9 of 9: User Input
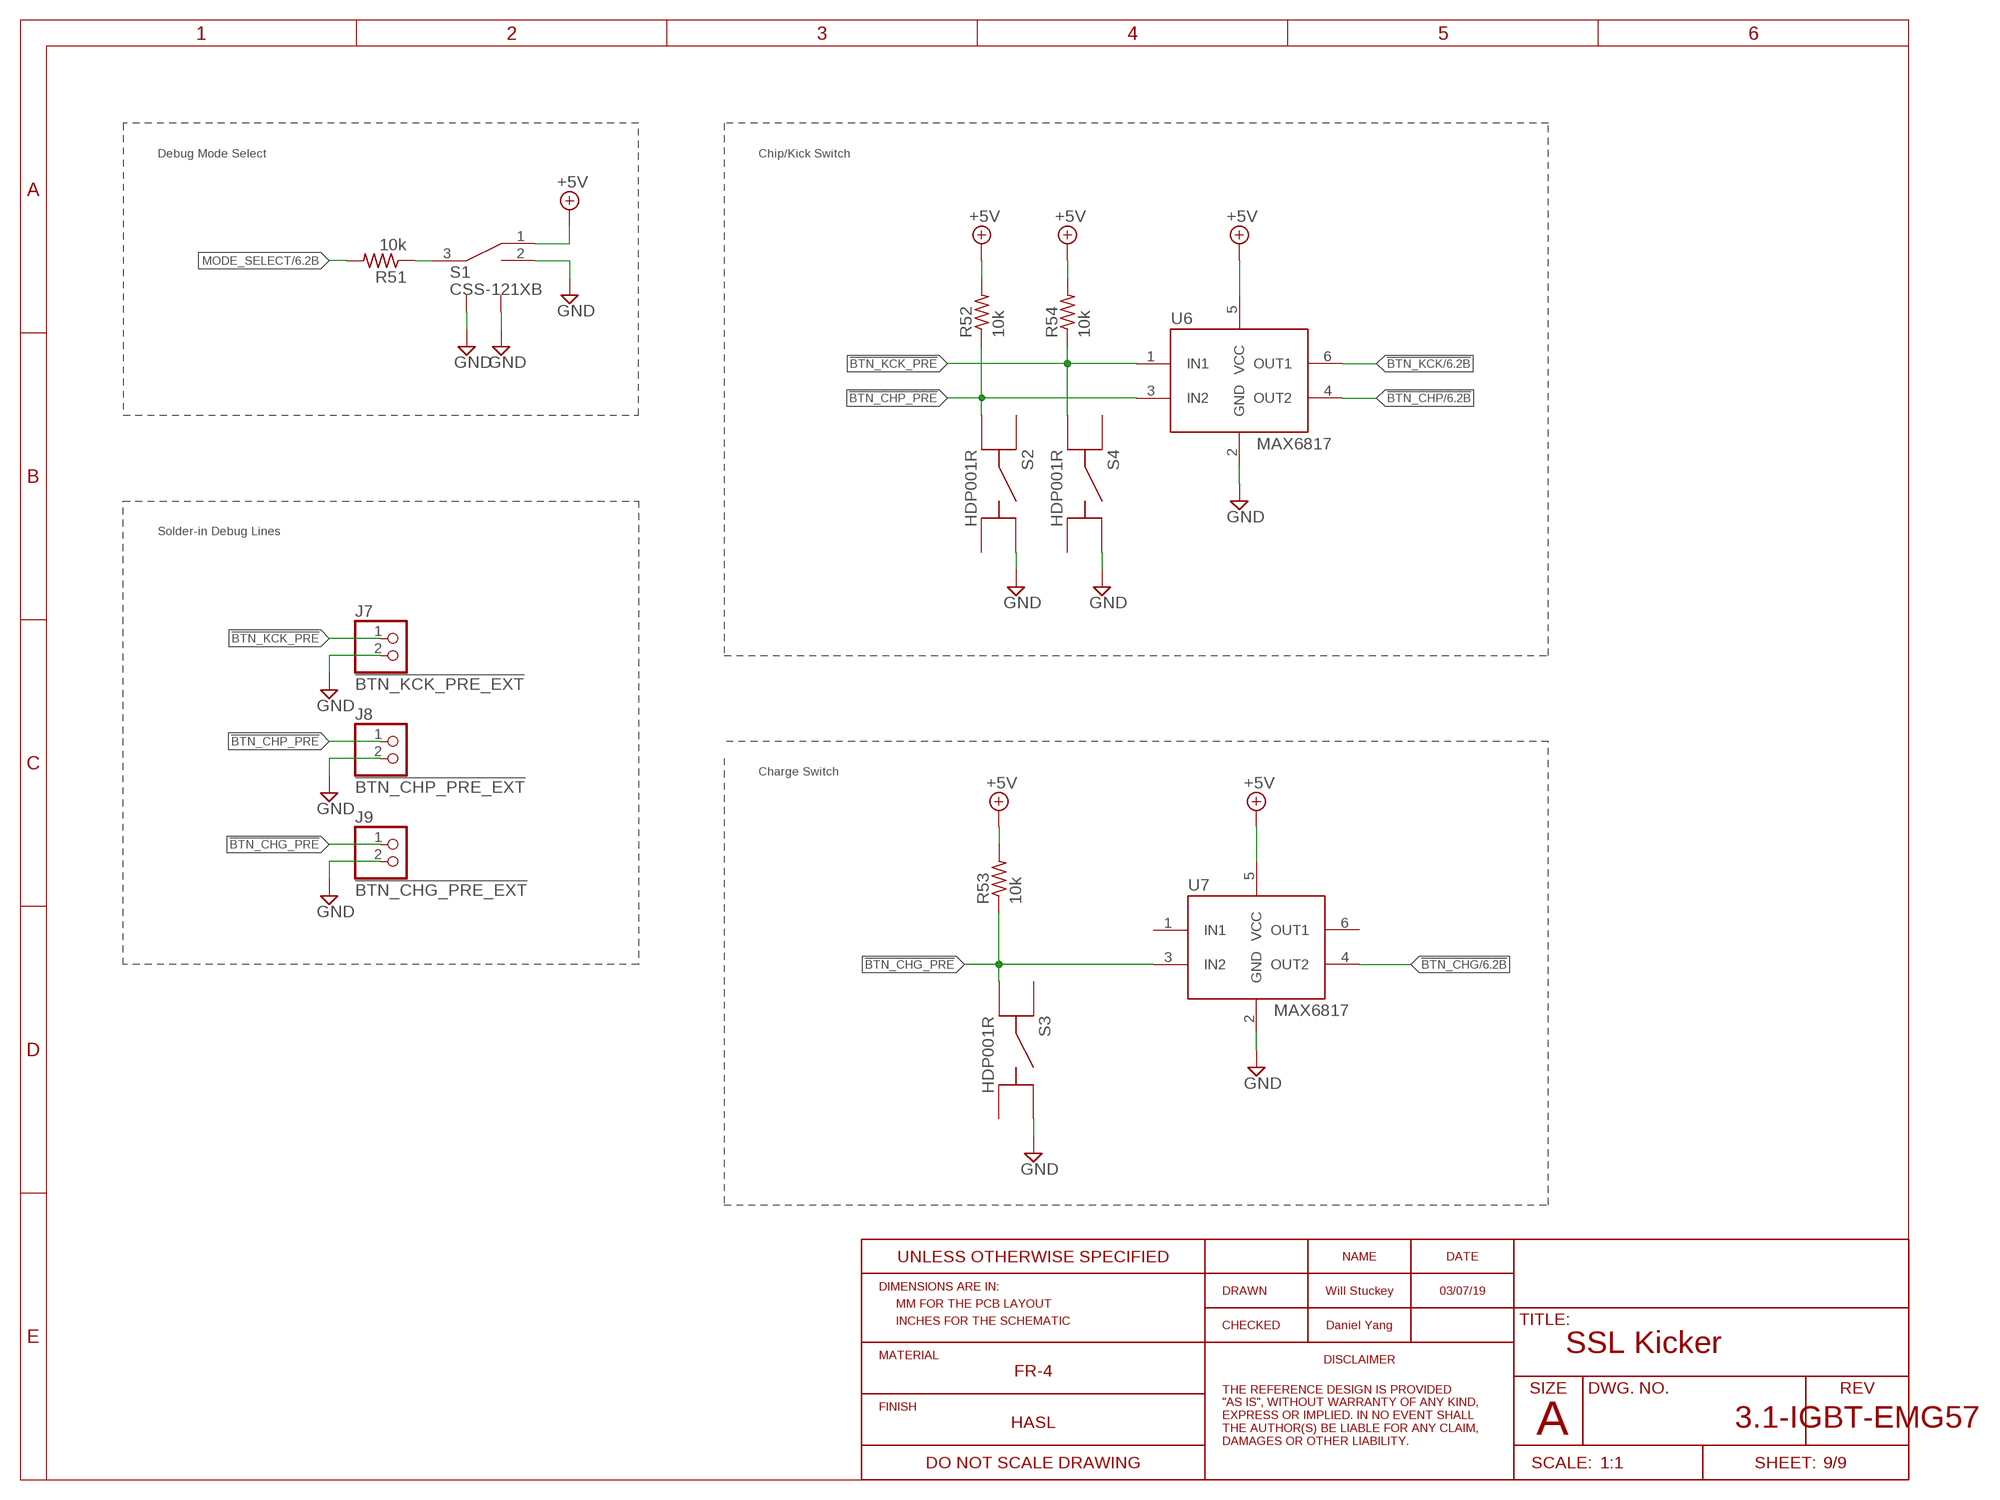
[diagram p8: schematic, sheet 9]

### Parts
J7  !BTN_KCK_PRE_EXT  CONN-2VERT  [1X2]
J8  !BTN_CHP_PRE_EXT  CONN-2VERT  [1X2]
J9  !BTN_CHG_PRE_EXT  CONN-2VERT  [1X2]
R51  10k  R-US_R0603  [R0603]
R52  10k  R-US_R0603  [R0603]
R53  10k  R-US_R0603  [R0603]
R54  10k  R-US_R0603  [R0603]
S1  CSS-121XB  [CSS-121XB]
S2  HDP001R  [HDP001R]
S3  HDP001R  [HDP001R]
S4  HDP001R  [HDP001R]
U6  MAX6817  [SOT-23-6]
U7  MAX6817  [SOT-23-6]

### Nets
!BTN_CHG: U7.4(OUT2) ; also sheet 6
!BTN_CHG_PRE: J9.1 R53.1 S3.C(A2) U7.3(IN2)
!BTN_CHP: U6.4(OUT2) ; also sheet 6
!BTN_CHP_PRE: J8.1 R52.1 S2.C(A2) U6.3(IN2)
!BTN_KCK: U6.6(OUT1) ; also sheet 6
!BTN_KCK_PRE: J7.1 R54.1 S4.C(A2) U6.1(IN1)
+5V: R52.2 R53.2 R54.2 S1.1(A) U6.5(VCC) U7.5(VCC) ; also sheet 1,3,6,7,8
GND: J7.2 J8.2 J9.2 S1.2(B) S1.LEG1 S1.LEG4(LEG2) S2.B(B1) S3.B(B1) S4.B(B1) U6.2(GND) U7.2(GND) ; also sheet 1,2,3,4,5,6,7,8
MODE_SELECT: R51.2 ; also sheet 6
N$14: R51.1 S1.3(COMMON)
Unconnected: S2.A(A1) S2.D(B2) S3.A(A1) S3.D(B2) S4.A(A1) S4.D(B2) U7.1(IN1) U7.6(OUT1)

### Notes on the sheet
- Debug Mode Select | Chip/Kick Switch
- Solder-in Debug Lines
- Charge Switch

## Library data of the parts
C1 C2 C5 C6 C13 C18 C19 C30-C35 = rcl:C-US: CAPACITOR, American symbol; SPICEPREFIX: C
C3 C4 C9 C20-C25 C27 C28 = rcl:C-US: CAPACITOR, American symbol
C7 C8 C10-C12 C14 = rcl:CPOL-US: POLARIZED CAPACITOR, American symbol; SPICEPREFIX: C
C26 C29 = resistor:C-US: CAPACITOR, American symbol
D1 D18 D19 D22 = RoboJackets-Diodes:VS-5EWH06FN-M3
D2 D4 D6 D13 = RoboJackets-LEDs:LED-SMD; DIGIKEY: 160-1446-1-ND; MPN: LTST-C191KGKT
D3 D12 = RoboJackets-LEDs:LED-SMD; DIGIKEY: 160-1647-1-ND; MPN: LTST-C191TBKT
D5 D7 D11 D20 = RoboJackets-LEDs:LED-SMD; DIGIKEY: 160-1448-1-ND; MPN: LTST-C191KSKT
D8-D10 D14 = RoboJackets-LEDs:LED-SMD; DIGIKEY: 160-1447-1-ND; MPN: LTST-C191KRKT
D15 D25 = RoboJackets-Diodes:DIODE-: DIODE
D16 D17 = RoboJackets-Diodes:SMAJ20A
D21 D23 D24 D27-D29 = RoboJackets-Diodes:TVS: Suppressor diode
J1 J3 J4 = RoboJackets-Connectors:B2P?-VH(LF)(SN): Power Connector Brand: JST Sales America Inc. <https://www.jst.com/> Series: VH <http://www.digikey.com/product-search/en?FV=fff40016,fff802f3,ffec0e9d> Distributor: Digi-Key <http://www.digikey.com/product-detail/en/B2PS-VH%28LF%29%28SN%29/455-1648-ND/926555>; DIGIKEY: 455-1648-ND; MPN: B2PS-VH(LF)(SN)
J2 = RoboJackets-Connectors:HFW8; DIGIKEY: 609-1788-1-ND; MPN: HFW8R-1STE1LF
J5 = RoboJackets-Connectors:2-PIN_2MM-*; PINS: 2; PIN_PITCH: 2.0 mm
J6 = RoboJackets-Connectors:3-PIN_2MM-*; PINS: 3; PIN_PITCH: 2.0 mm
J7-J9 = RoboJackets-Connectors:CONN-2
Q1 = RoboJackets-Discrete:ATP302
Q2 = RoboJackets-Discrete:IRFS4227
Q3-Q6 = RoboJackets-Discrete:BSS127
Q7 = RoboJackets-Discrete:AOD1N60
Q10 = RoboJackets-Discrete:BSS806N
R1 R2 R5-R18 R56 R66 = resistor:R-US_: RESISTOR, American symbol
R3 R4 R19-R25 R27 R29-R37 R39-R43 R46-R55 R57 R58 R65 = rcl:R-US_: RESISTOR, American symbol
R26 R28 R44 R45 R59-R62 = rcl:R-US_: RESISTOR, American symbol; SPICEPREFIX: R
R38 = RoboJackets-Resistors:PWR263S-35
S1 = RoboJackets-Switches:CSS-121XB
S2-S4 = RoboJackets-Switches:HDP001?
T1 = RoboJackets-Inductors:DA203X-AL
U1 = RoboJackets-PowerICs:MPM3620GQV-P
U2 = RoboJackets-PowerICs:MIC5235YM5
U3 = RoboJackets-ICs:LT3757
U4 = RoboJackets-ICs:AT32A
U5 = RoboJackets-PowerICs:IX4427
U6 U7 = RoboJackets-ICs:MAX6817
U$6 U$7 = RoboJackets-Discrete:IXGK400N30A3
XF1 = RoboJackets-Fuses:3557-2; DIGIKEY: 36-3557-2-ND; MPN: 3557-2

## Net classes
0 default: clearance 0.205 mm